# EAGLE schematic kicker (EAGLE 9.6.2)
DDRAWN: 12/31/21; DWG_NO: 1; FINISH: HASL; MATERIAL: FR-4; NDRAWN: Arvind Srinivasan; REV: 4.0; SCALE: 1:1; TITLE: RoboCup SSL Kicker

## Sheet 1 of 9: Power
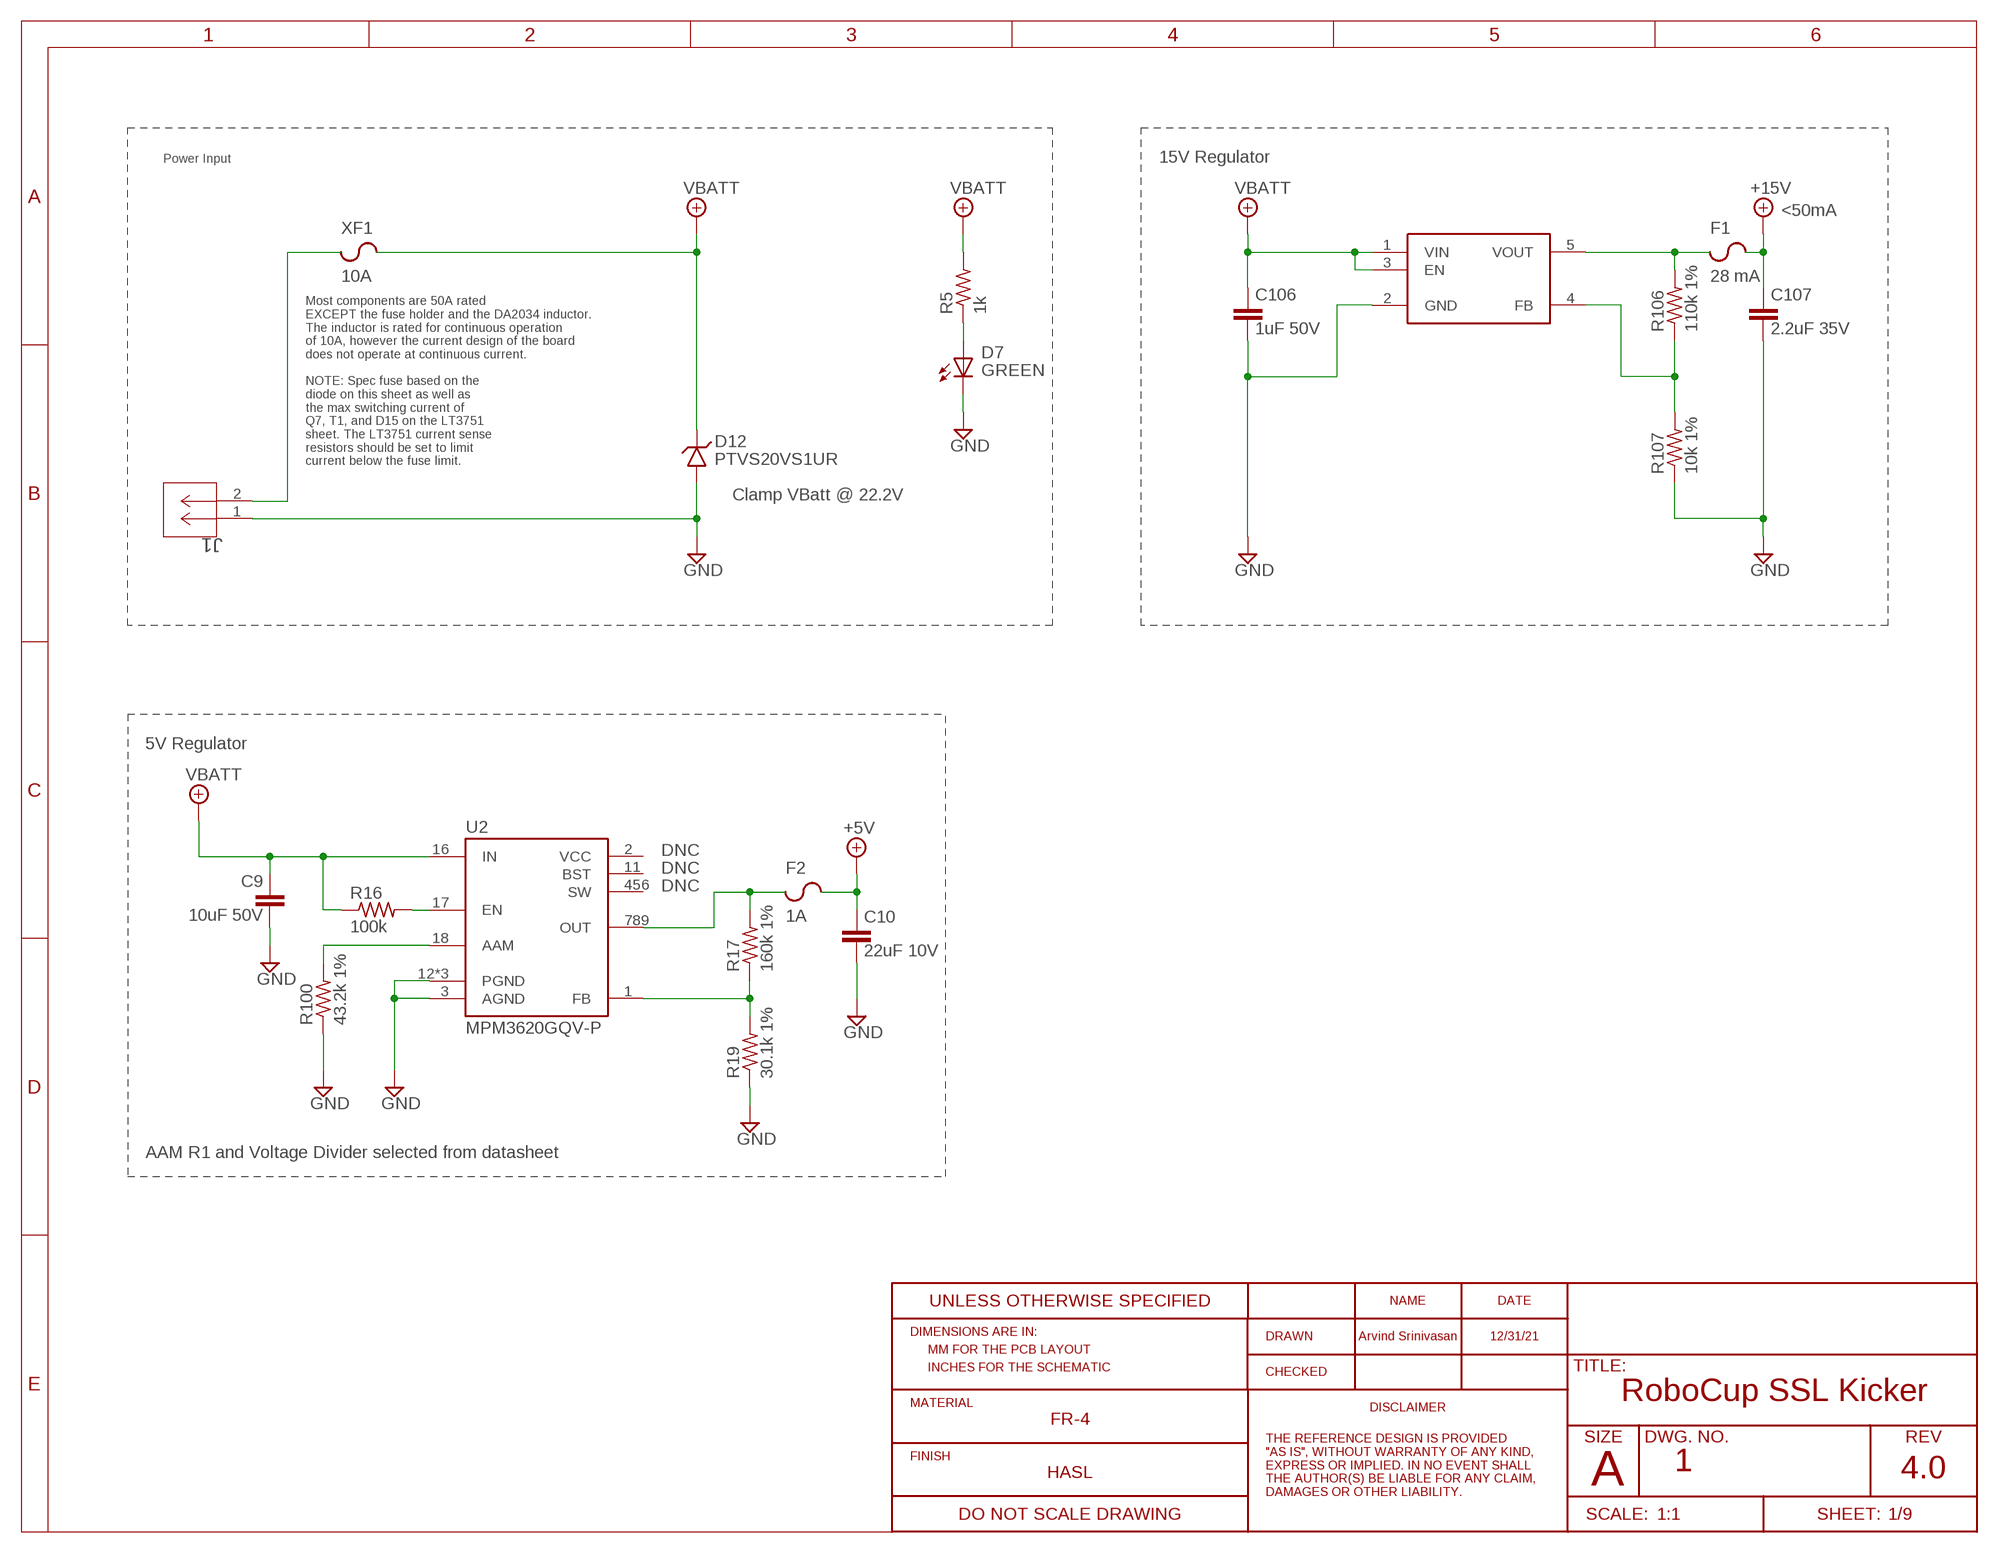
[diagram p0: schematic, sheet 1]
FRAME1 (RO_FRAME_A_L_20161226): REV: 4.0

### Parts
C9  10uF 50V  C-EUC1206  [C1206]
C10  22uF 10V  C-EUC0603  [C0603]
C106  1uF 50V  C-EUC0603  [C0603]
C107  2.2uF 35V  C-EUC0603  [C0603]
D7  GREEN  LED-SMD-GREEN  [CHIP-LED0603]
D12  PTVS20VS1UR  TVSSOD123W  [SOD123-W]
F1  28 mA  CHIP_FUSE0603  [F0603]
F2  1A  CHIP_FUSE0603  [F0603]
J1  436500217  [CON_436500217_MOL]
R5  1k  R-US_R0603  [R0603]
R16  100k  R-US_R0603  [R0603]
R17  160k 1%  R-US_R0603  [R0603]
R19  30.1k 1%  R-US_R0603  [R0603]
R100  43.2k 1%  R-US_R0603  [R0603]
R106  110k 1%  R-US_R0603  [R0603]
R107  10k 1%  R-US_R0603  [R0603]
U2  MPM3620GQV-P  [MPM3620GQV-P]
U100  15V  MIC5235YM5SOT-23-5  [SOT95P280X145-5]
XF1  10A  3557-2  [3557-2]

### Nets
15V_PWR_BR1: D7.A R5.1
+5V: C10.1 F2.2 ; also sheet 3,6,7,8,9
+15V: C107.1 F1.2 ; also sheet 4,7
FB: R17.1 R19.2 U2.1(FB)
GND: C9.2 C10.2 C106.2 C107.2 D7.C(K) D12.A J1.1 R19.1 R100.1 R107.1 U2.3(AGND) U2.12(PGND) U2.13(PGND) U2.14(PGND) U100.2(GND) ; also sheet 2,3,4,5,6,7,8,9
N$6: F1.1 R106.2 U100.5(VOUT)
N$7: F2.1 R17.2 U2.789(OUT)
N$16: R106.1 R107.2 U100.4(FB)
N$39: J1.2 XF1.1 XF1.2
REG_AAM: R100.2 U2.18(AAM)
REG_EN: R16.2 U2.17(EN)
VBATT: C9.1 C106.1 D12.C R5.2 R16.1 U2.16(IN) U100.1(VIN) U100.3(EN) XF1.3 XF1.4 ; also sheet 2,3,5
Unconnected: U2.2(VCC) U2.11(BST) U2.456(SW)

### Notes on the sheet
- Power Input | 15V Regulator
- <50mA
- Most components are 50A rated
  EXCEPT the fuse holder and the DA2034 inductor.
  The inductor is rated for continuous operation
  of 10A, however the current design of the board
  does not operate at continuous current.
- NOTE: Spec fuse based on the
  diode on this sheet as well as
  the max switching current of 
  Q7, T1, and D15 on the LT3751
  sheet. The LT3751 current sense
  resistors should be set to limit
  current below the fuse limit.
- Clamp VBatt @ 22.2V
- 5V Regulator
- DNC
- DNC
- DNC
- AAM R1 and Voltage Divider selected from datasheet

## Sheet 2 of 9: HV - Regulation
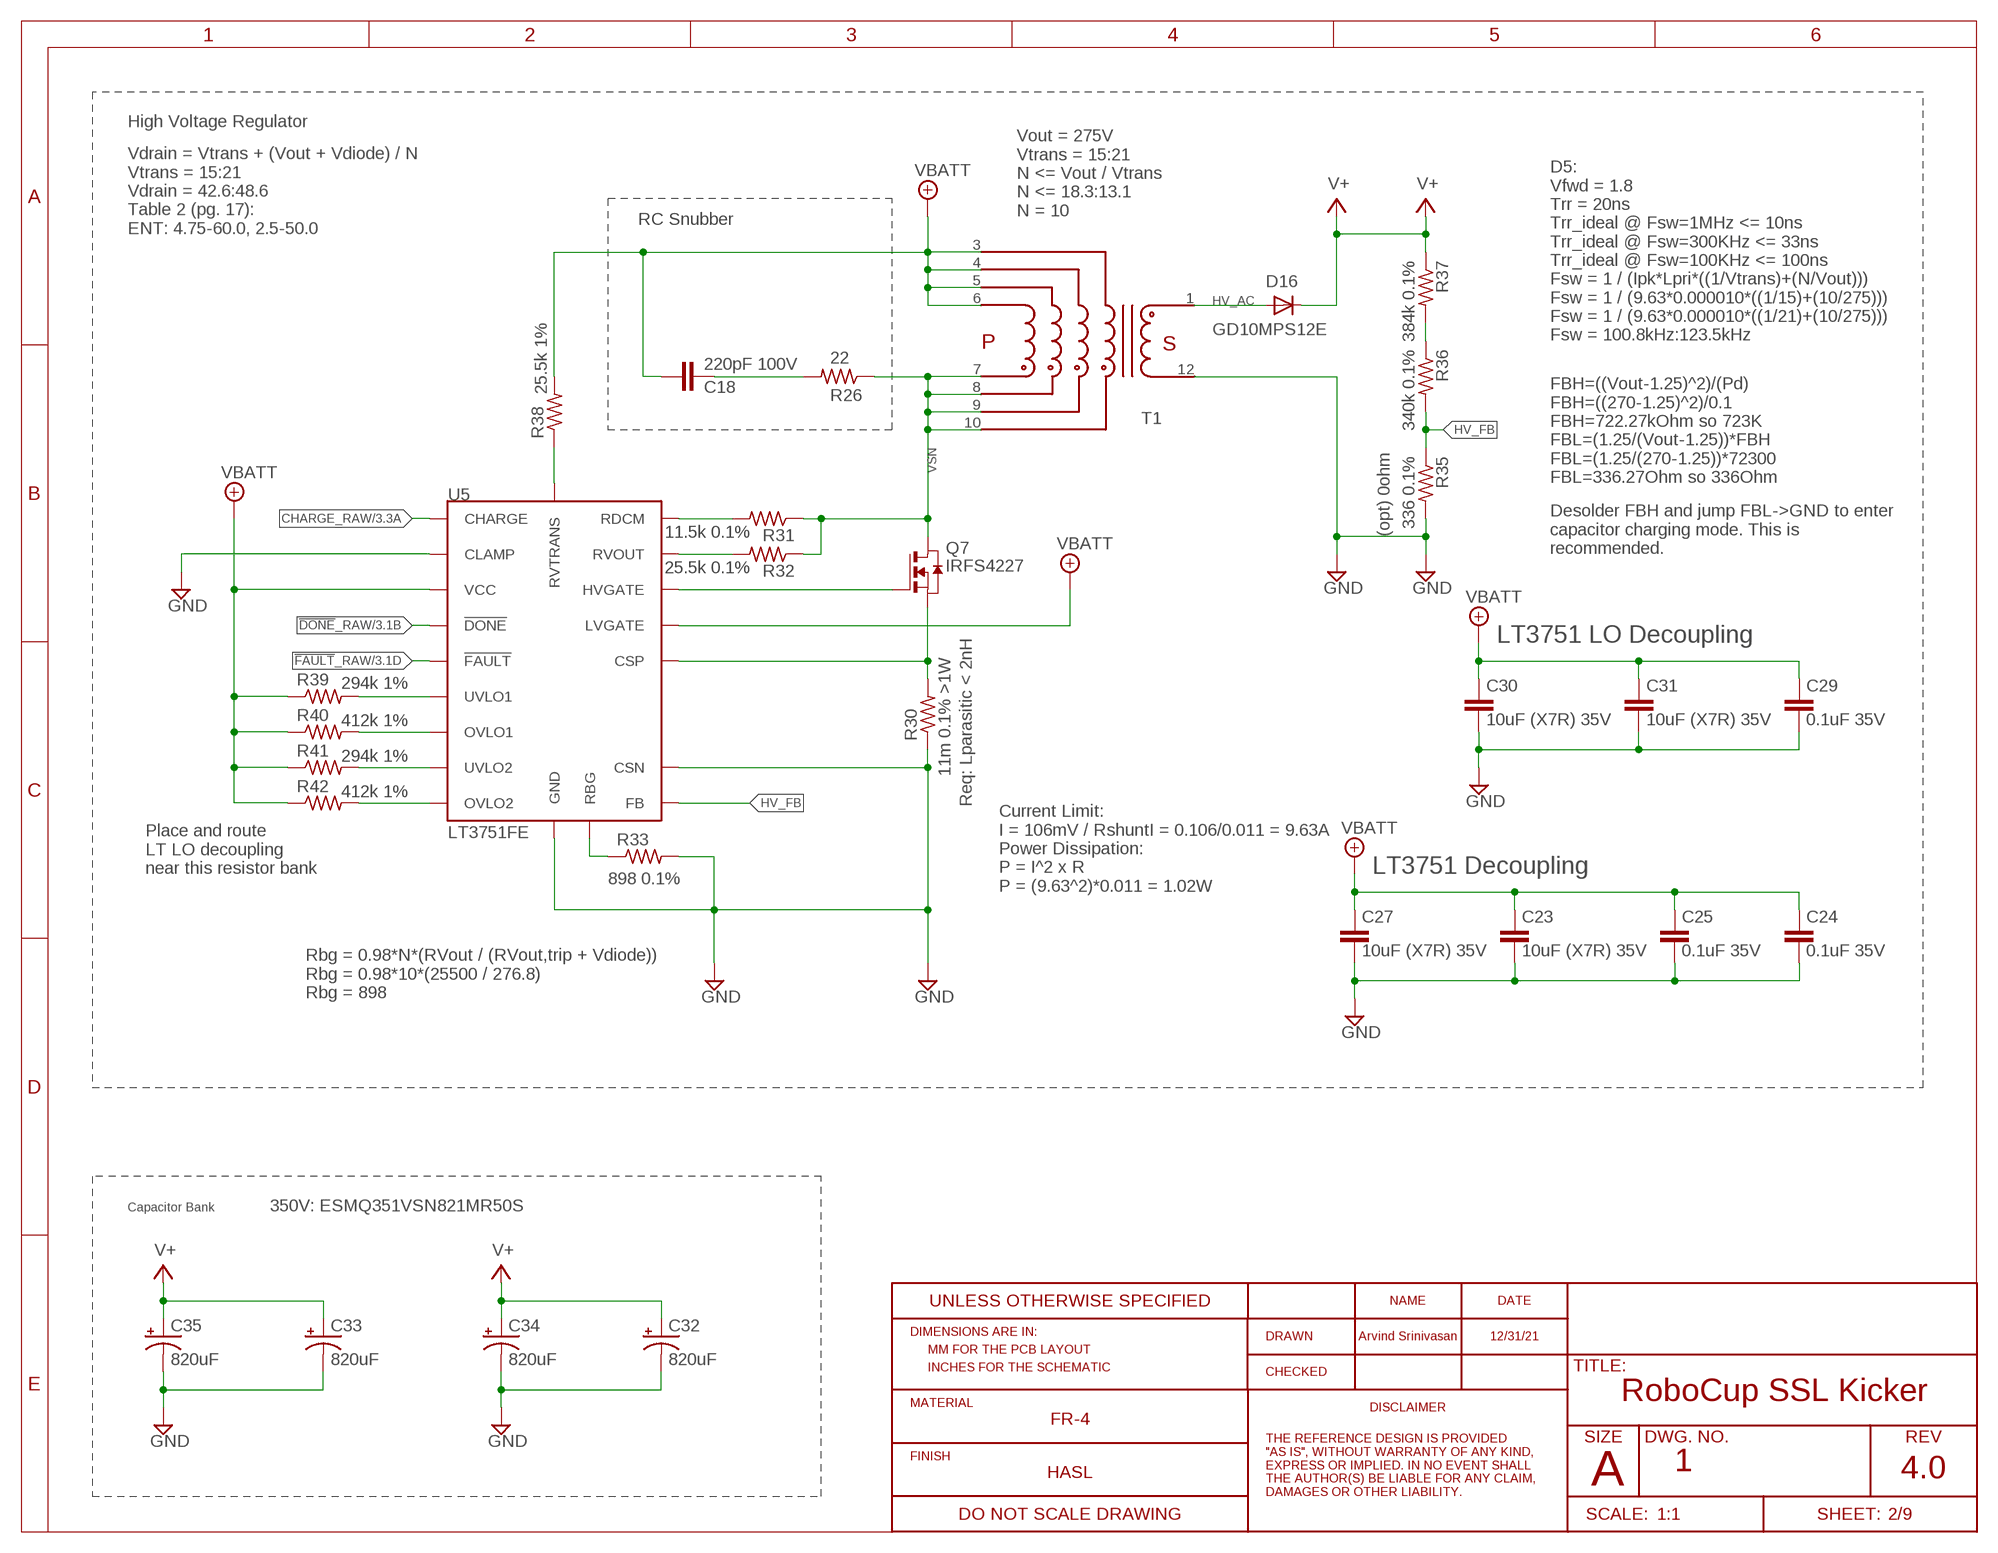
[diagram p1: schematic, sheet 2]
FRAME2 (RO_FRAME_A_L_20161226): REV: 4.0

### Parts
C18  220pF 100V  C-EUC0805  [C0805]
C23  10uF (X7R) 35V  C-EUC1210  [C1210]
C24  0.1uF 35V  C-EUC0805  [C0805]
C25  0.1uF 35V  C-EUC0805  [C0805]
C27  10uF (X7R) 35V  C-EUC1210  [C1210]
C29  0.1uF 35V  C-EUC0805  [C0805]
C30  10uF (X7R) 35V  C-EUC1210  [C1210]
C31  10uF (X7R) 35V  C-EUC1210  [C1210]
C32  820uF  CPOL-USE10-25  [EB25D]
C33  820uF  CPOL-USE10-25  [EB25D]
C34  820uF  CPOL-USE10-25  [EB25D]
C35  820uF  CPOL-USE10-25  [EB25D]
D16  GD10MPS12E  VS-5EWH06FN-M3D-PAK_TO252AA  [TO460P990X239-3]
Q7  IRFS4227  [D2PAK]
R26  22  R-US_R0805  [R0805]
R30  11m 0.1% >1W  R-US_R2512  [R2512]
R31  11.5k 0.1%  R-US_R0805  [R0805]
R32  25.5k 0.1%  R-US_R0805  [R0805]
R33  898 0.1%  R-US_R0805  [R0805]
R35  336 0.1%  R-US_R0603  [R0603]
R36  340k 0.1%  R-US_R0603  [R0603]
R37  384k 0.1%  R-US_R0603  [R0603]
R38  25.5k 1%  R-US_R0805  [R0805]
R39  294k 1%  R-US_R0805  [R0805]
R40  412k 1%  R-US_R0805  [R0805]
R41  294k 1%  R-US_R0805  [R0805]
R42  412k 1%  R-US_R0805  [R0805]
T1  DA203X-ALDA2034  [DA2034]
U5  LT3751FE  [TSSOP-20_EP]

### Nets
!DONE!_RAW: U5.7(!DONE) ; also sheet 3,7
!FAULT!_RAW: U5.6(!FAULT) ; also sheet 3,7
CHARGE_RAW: U5.8(CHARGE) ; also sheet 3
CSP: Q7.3(S) R30.2 U5.12(CSP)
GND: C23.2 C24.2 C25.2 C27.2 C29.2 C30.2 C31.2 C32.- C33.- C34.- C35.- R30.1 R33.2 R35.2 T1.12 U5.9(CLAMP) U5.11(CSN) U5.PAD(GND) ; also sheet 1,3,4,5,6,7,8,9
HV_AC: D16.2(A) T1.1
HV_FB: R35.1 R36.2 U5.10(FB)
HVGATE: Q7.1(G) U5.15(HVGATE)
N$1: R33.1 U5.16(RBG)
N$2: R36.1 R37.2
N$18: C18.1 R26.2
N$24: R38.1 U5.1(RVTRANS)
OVLO1: R40.2 U5.3(OVLO1)
OVLO2: R42.2 U5.5(OVLO2)
RDCM: R31.2 U5.20(RDCM)
RVOUT: R32.2 U5.18(RVOUT)
UVLO1: R39.2 U5.2(UVLO1)
UVLO2: R41.2 U5.4(UVLO2)
V+: C32.+ C33.+ C34.+ C35.+ D16.3(C) R37.1 ; also sheet 4,5,6,7
VBATT: C18.2 C23.1 C24.1 C25.1 C27.1 C29.1 C30.1 C31.1 R38.2 R39.1 R40.1 R41.1 R42.1 T1.3 T1.4 T1.5 T1.6 U5.13(VCC) U5.14(LVGATE) ; also sheet 1,3,5
VSN: Q7.2(D) R26.1 R31.1 R32.1 T1.7 T1.8 T1.9 T1.10

### Notes on the sheet
- High Voltage Regulator
- Vout = 275V
  Vtrans = 15:21
  N <= Vout / Vtrans
  N <= 18.3:13.1
  N = 10
- RC Snubber
- Vdrain = Vtrans + (Vout + Vdiode) / N
  Vtrans = 15:21
  Vdrain = 42.6:48.6
  Table 2 (pg. 17):
  ENT: 4.75-60.0, 2.5-50.0
- D5:
  Vfwd = 1.8
  Trr = 20ns
  Trr_ideal @ Fsw=1MHz <= 10ns
  Trr_ideal @ Fsw=300KHz <= 33ns
  Trr_ideal @ Fsw=100KHz <= 100ns
  Fsw = 1 / (Ipk*Lpri*((1/Vtrans)+(N/Vout)))
  Fsw = 1 / (9.63*0.000010*((1/15)+(10/275)))
  Fsw = 1 / (9.63*0.000010*((1/21)+(10/275)))
  Fsw = 100.8kHz:123.5kHz
- FBH=((Vout-1.25)^2)/(Pd)
  FBH=((270-1.25)^2)/0.1
  FBH=722.27kOhm so 723K
  FBL=(1.25/(Vout-1.25))*FBH
  FBL=(1.25/(270-1.25))*72300
  FBL=336.27Ohm so 336Ohm
- (opt) 0ohm
- Desolder FBH and jump FBL->GND to enter
  capacitor charging mode. This is
  recommended.
- LT3751 LO Decoupling
- Req: Lparasitic < 2nH
- Place and route
  LT LO decoupling
  near this resistor bank
- LT3751 Decoupling
- Current Limit:
  I = 106mV / RshuntI = 0.106/0.011 = 9.63A
  Power Dissipation:
  P = I^2 x R
  P = (9.63^2)*0.011 = 1.02W
- Rbg = 0.98*N*(RVout / (RVout,trip + Vdiode))
  Rbg = 0.98*10*(25500 / 276.8)
  Rbg = 898
- Capacitor Bank | 350V: ESMQ351VSN821MR50S

## Sheet 3 of 9: HV - Control & Bypass
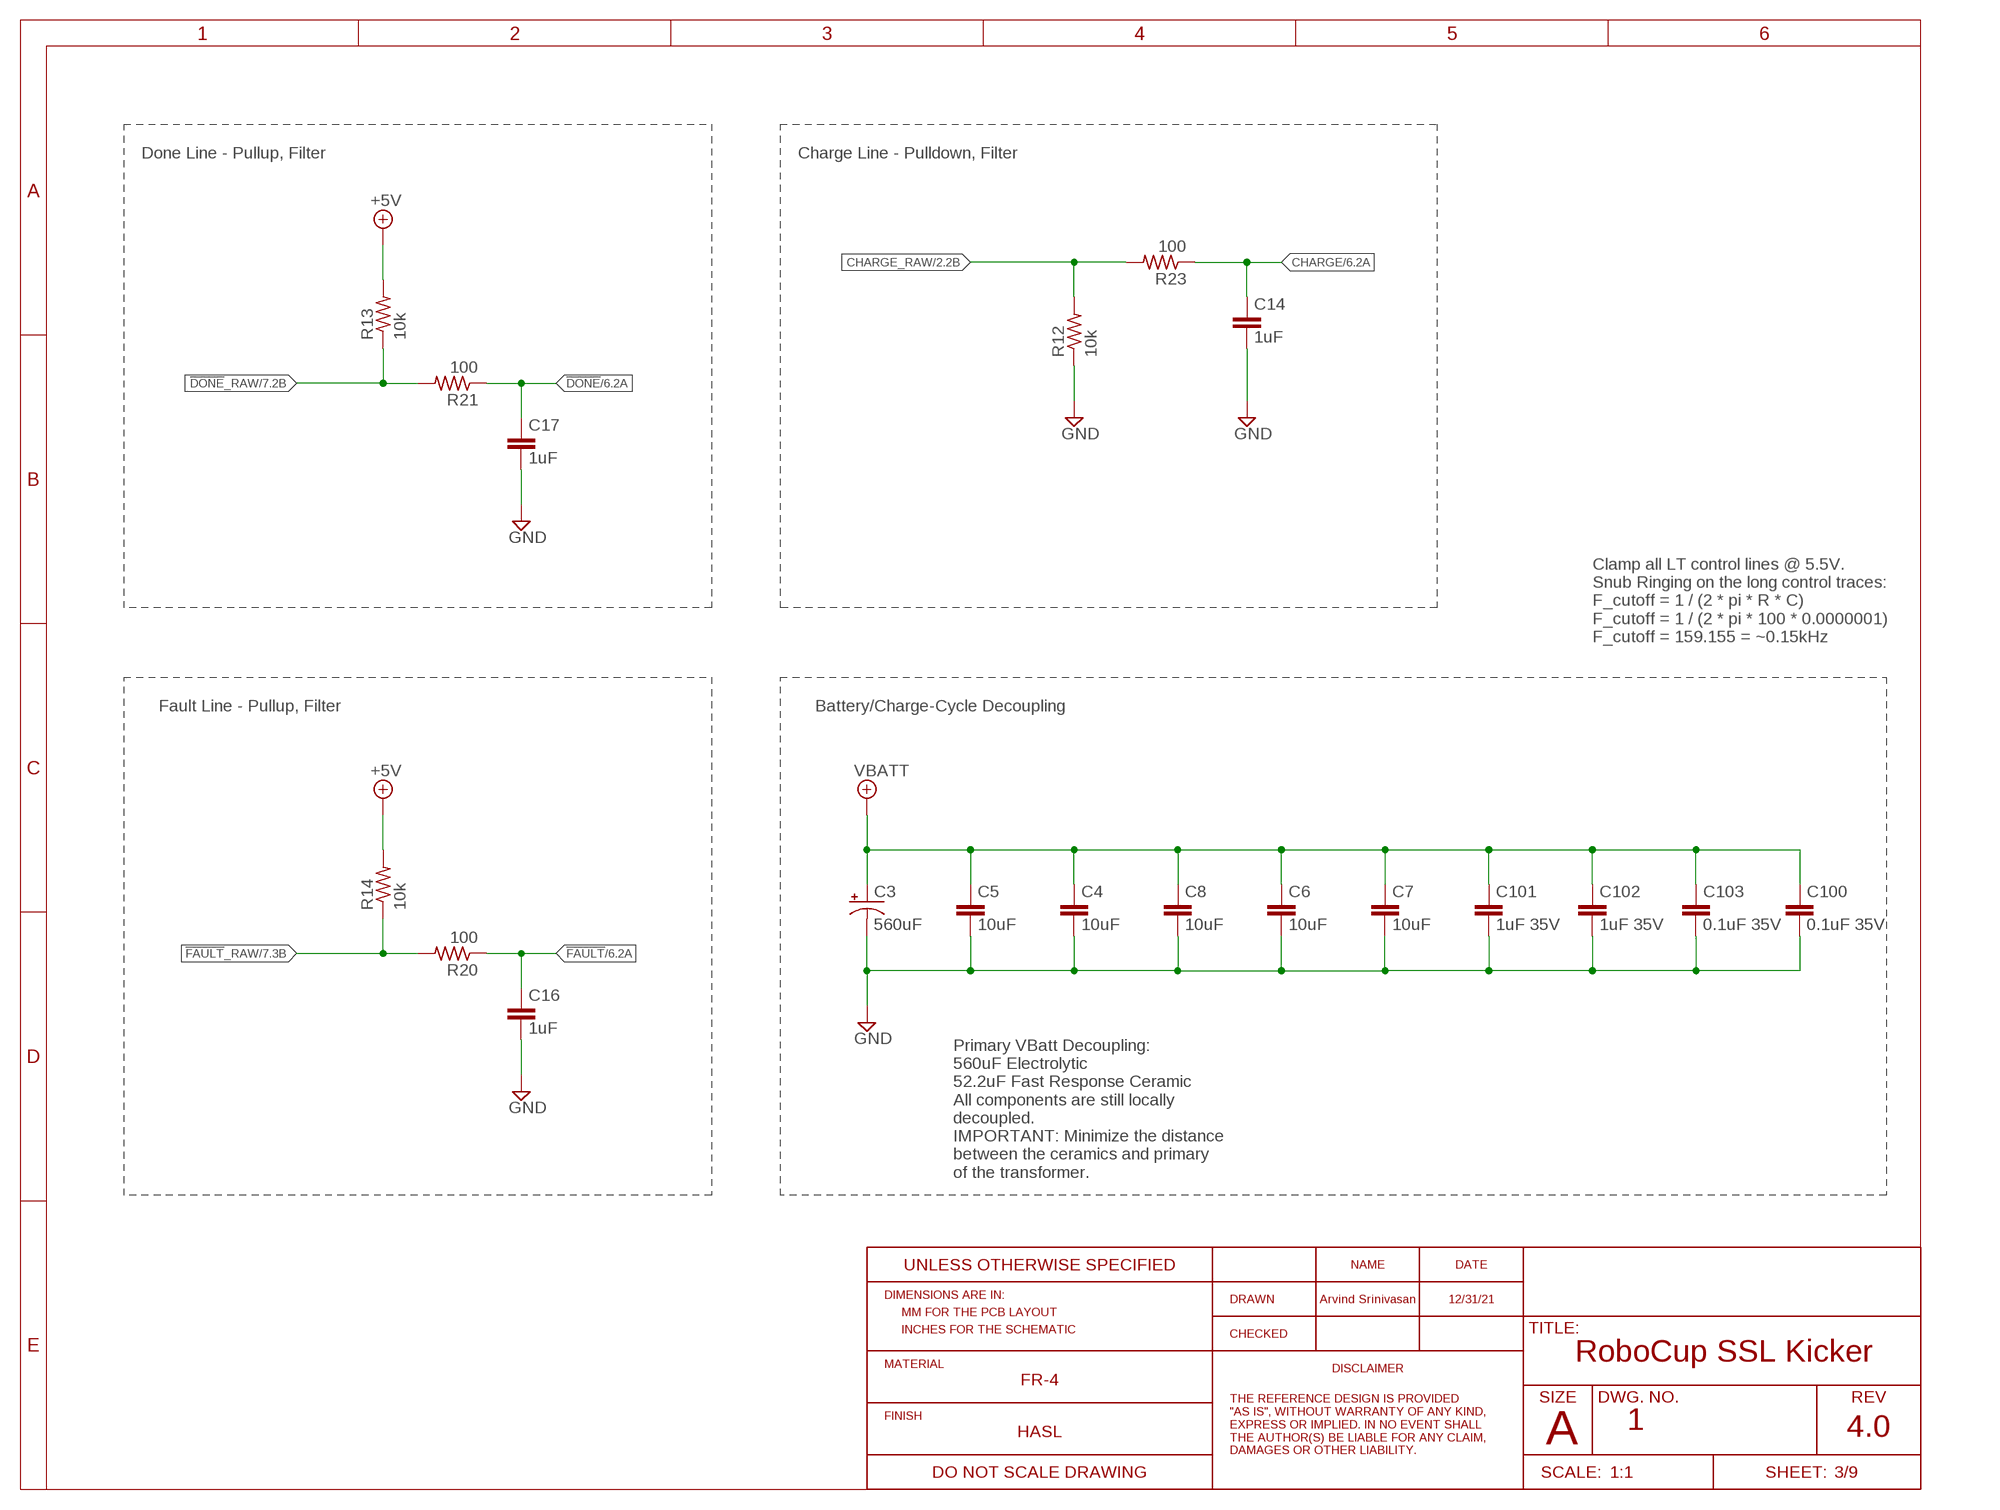
[diagram p2: schematic, sheet 3]

### Parts
C3  560uF  CPOL-USE7.5-18  [E7,5-18]
C4  10uF  C-EUC1210  [C1210]
C5  10uF  C-EUC1210  [C1210]
C6  10uF  C-EUC1210  [C1210]
C7  10uF  C-EUC1210  [C1210]
C8  10uF  C-EUC1210  [C1210]
C14  1uF  C-EUC0603  [C0603]
C16  1uF  C-EUC0603  [C0603]
C17  1uF  C-EUC0603  [C0603]
C100  0.1uF 35V  C-EUC0805  [C0805]
C101  1uF 35V  C-EUC0805  [C0805]
C102  1uF 35V  C-EUC0805  [C0805]
C103  0.1uF 35V  C-EUC0805  [C0805]
R12  10k  R-US_R0603  [R0603]
R13  10k  R-US_R0603  [R0603]
R14  10k  R-US_R0603  [R0603]
R20  100  R-US_R0603  [R0603]
R21  100  R-US_R0603  [R0603]
R23  100  R-US_R0603  [R0603]

### Nets
!DONE!: C17.1 R21.1 ; also sheet 6
!DONE!_RAW: R13.1 R21.2 ; also sheet 2,7
!FAULT!: C16.1 R20.1 ; also sheet 6
!FAULT!_RAW: R14.1 R20.2 ; also sheet 2,7
+5V: R13.2 R14.2 ; also sheet 1,6,7,8,9
CHARGE: C14.1 R23.1 ; also sheet 6
CHARGE_RAW: R12.2 R23.2 ; also sheet 2
GND: C3.- C4.2 C5.2 C6.2 C7.2 C8.2 C14.2 C16.2 C17.2 C100.2 C101.2 C102.2 C103.2 R12.1 ; also sheet 1,2,4,5,6,7,8,9
VBATT: C3.+ C4.1 C5.1 C6.1 C7.1 C8.1 C100.1 C101.1 C102.1 C103.1 ; also sheet 1,2,5

### Notes on the sheet
- Done Line - Pullup, Filter | Charge Line - Pulldown, Filter
- Clamp all LT control lines @ 5.5V.
  Snub Ringing on the long control traces:
  F_cutoff = 1 / (2 * pi * R * C)
  F_cutoff = 1 / (2 * pi * 100 * 0.0000001)
  F_cutoff = 159.155 = ~0.15kHz
- Fault Line - Pullup, Filter | Battery/Charge-Cycle Decoupling
- Primary VBatt Decoupling:
  560uF Electrolytic
  52.2uF Fast Response Ceramic
  All components are still locally
  decoupled.
  IMPORTANT: Minimize the distance
  between the ceramics and primary
  of the transformer.

## Sheet 4 of 9: HV - Kick Discharge
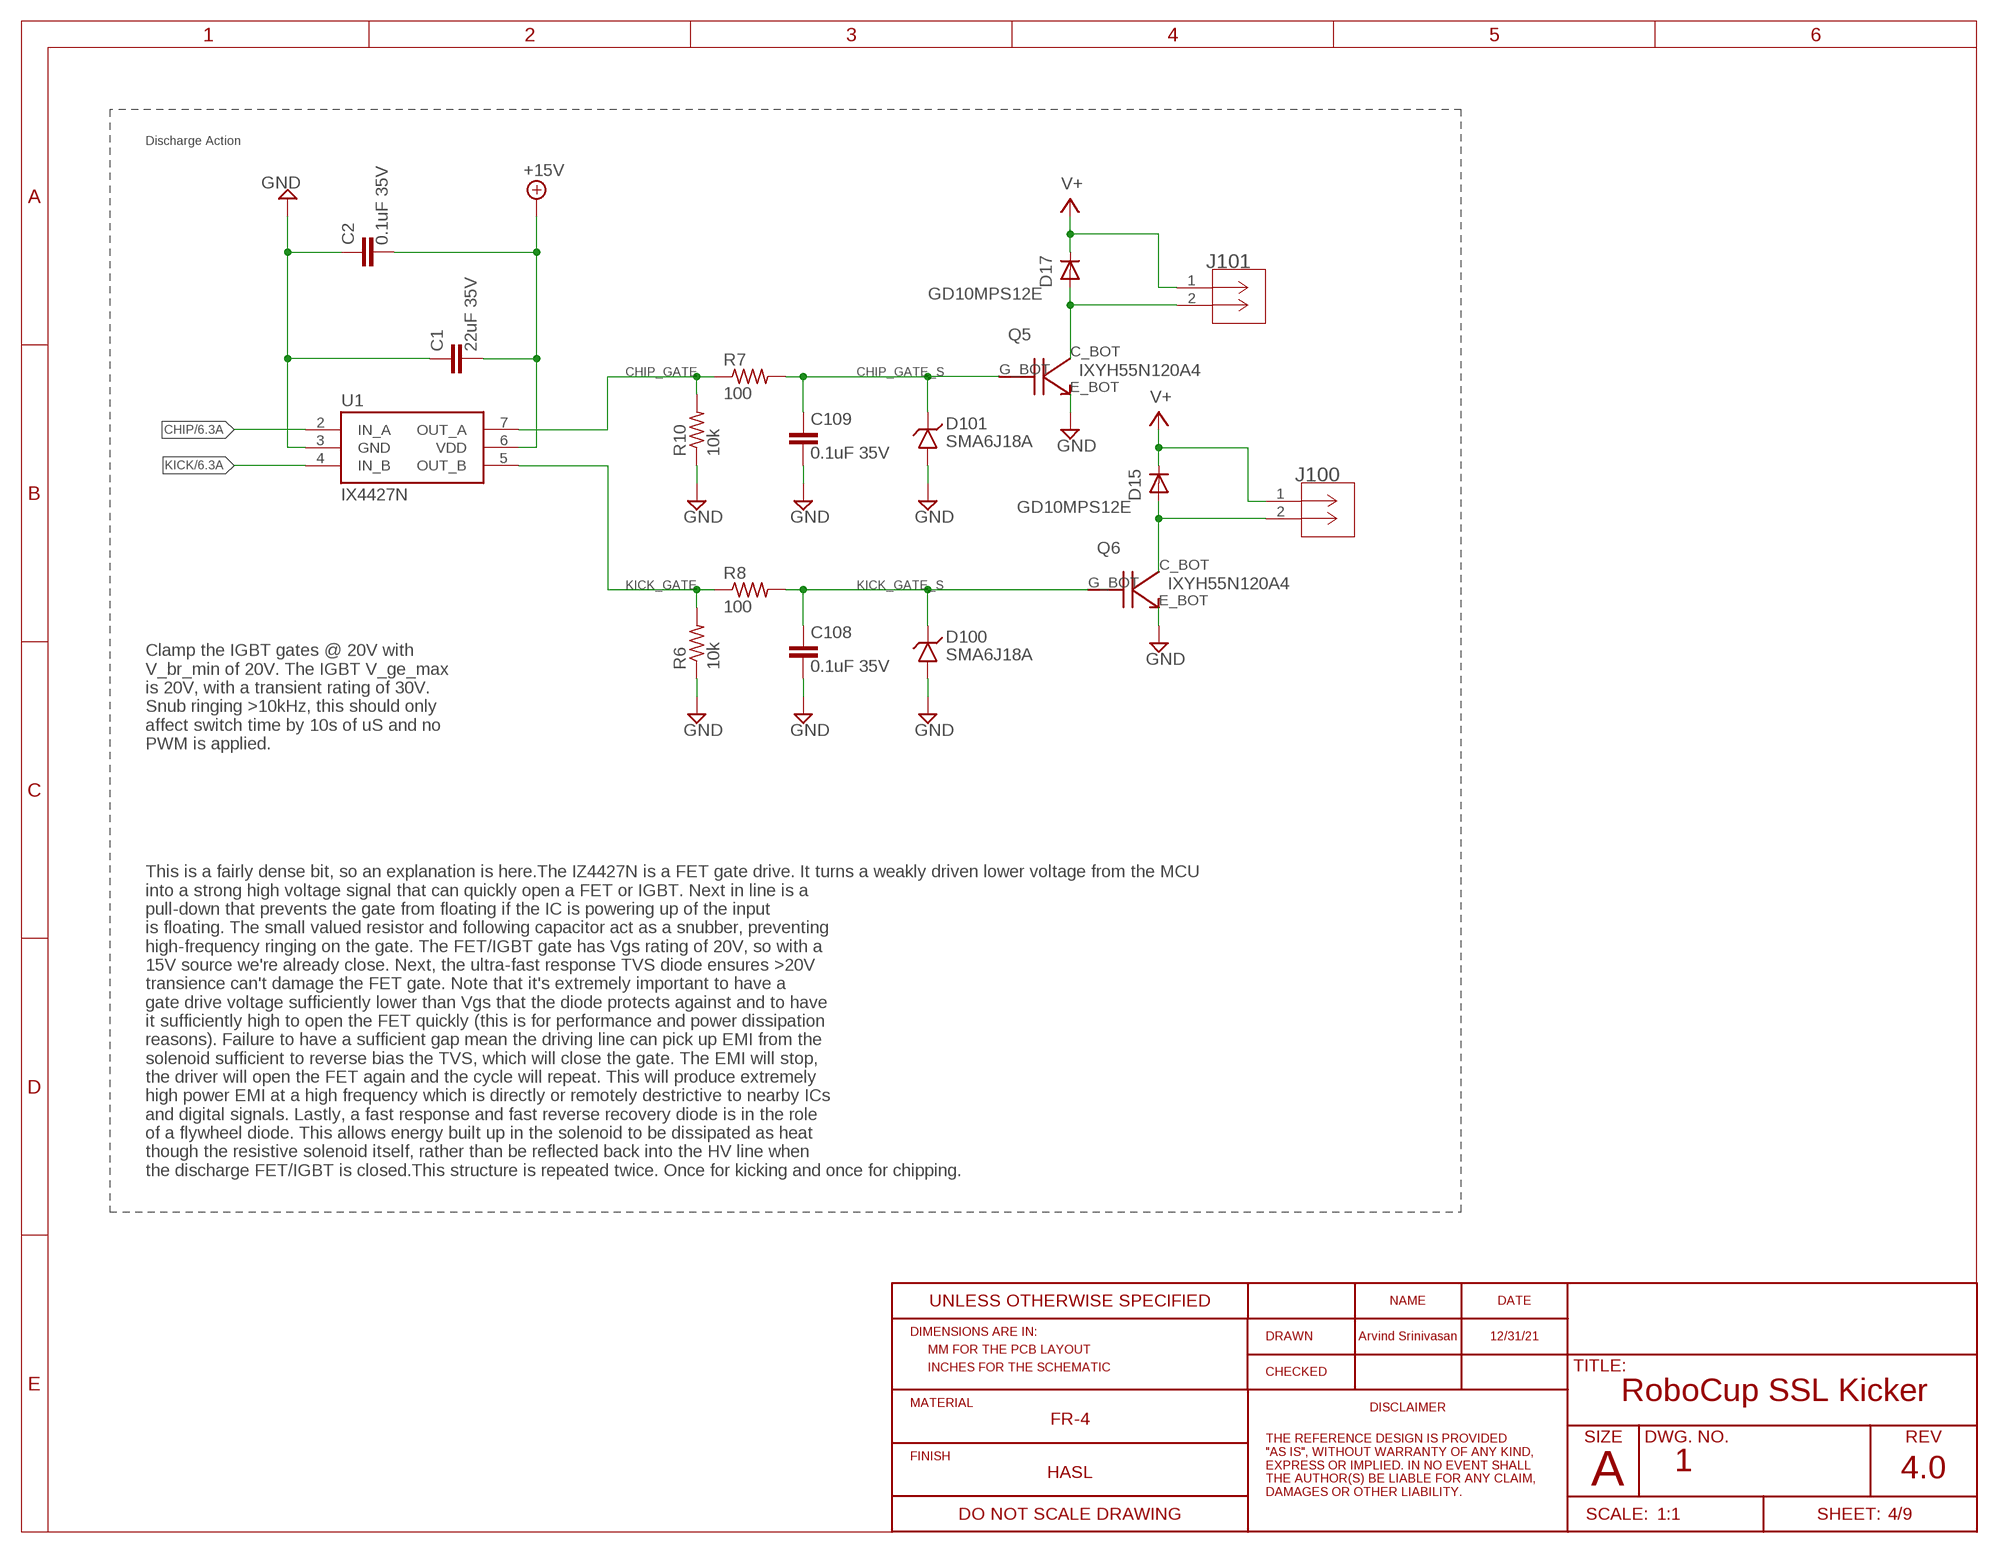
[diagram p3: schematic, sheet 4]

### Parts
C1  22uF 35V  C-EUC0805  [C0805]
C2  0.1uF 35V  C-EUC0805  [C0805]
C108  0.1uF 35V  C-EUC0603  [C0603]
C109  0.1uF 35V  C-EUC0603  [C0603]
D15  GD10MPS12E  VS-5EWH06FN-M3D-PAK_TO252AA  [TO460P990X239-3]
D17  GD10MPS12E  VS-5EWH06FN-M3D-PAK_TO252AA  [TO460P990X239-3]
D100  SMA6J18A  SMAJ20ADO-214AC  [RESM5226X262]
D101  SMA6J18A  SMAJ20ADO-214AC  [RESM5226X262]
J100  436500202  [CON_436500202_MOL]
J101  436500202  [CON_436500202_MOL]
Q5  IXYH55N120A4  IXGK400N30A3  [TO264]
Q6  IXYH55N120A4  IXGK400N30A3  [TO264]
R6  10k  R-US_R0603  [R0603]
R7  100  R-US_R1206  [R1206]
R8  100  R-US_R1206  [R1206]
R10  10k  R-US_R0603  [R0603]
U1  IX4427N  [SOIC-8]

### Nets
+15V: C1.2 C2.2 U1.6(VDD) ; also sheet 1,7
CHIP: U1.2(IN_A) ; also sheet 6
CHIP_GATE: R7.1 R10.2 U1.7(OUT_A)
CHIP_GATE_S: C109.1 D101.2(C) Q5.G_BOT(G) R7.2
CHIPPER: D17.2(A) J101.2 Q5.C_BOT(C)
GND: C1.1 C2.1 C108.2 C109.2 D100.1(A) D101.1(A) Q5.E_BOT(E) Q6.E_BOT(E) R6.1 R10.1 U1.3(GND) ; also sheet 1,2,3,5,6,7,8,9
KICK: U1.4(IN_B) ; also sheet 6
KICK_GATE: R6.2 R8.1 U1.5(OUT_B)
KICK_GATE_S: C108.1 D100.2(C) Q6.G_BOT(G) R8.2
KICKER: D15.2(A) J100.2 Q6.C_BOT(C)
V+: D15.3(C) D17.3(C) J100.1 J101.1 ; also sheet 2,5,6,7

### Notes on the sheet
- Discharge Action
- Clamp the IGBT gates @ 20V with
  V_br_min of 20V. The IGBT V_ge_max
  is 20V, with a transient rating of 30V.
  Snub ringing >10kHz, this should only
  affect switch time by 10s of uS and no
  PWM is applied.
- This is a fairly dense bit, so an explanation is here.The IZ4427N is a FET gate drive. It turns a weakly driven lower voltage from the MCU
  into a strong high voltage signal that can quickly open a FET or IGBT. Next in line is a
  pull-down that prevents the gate from floating if the IC is powering up of the input
  is floating. The small valued resistor and following capacitor act as a snubber, preventing
  high-frequency ringing on the gate. The FET/IGBT gate has Vgs rating of 20V, so with a
  15V source we're already close. Next, the ultra-fast response TVS diode ensures >20V
  transience can't damage the FET gate. Note that it's extremely important to have a
  gate drive voltage sufficiently lower than Vgs that the diode protects against and to have
  it sufficiently high to open the FET quickly (this is for performance and power dissipation
  reasons). Failure to have a sufficient gap mean the driving line can pick up EMI from the
  solenoid sufficient to reverse bias the TVS, which will close the gate. The EMI will stop,
  the driver will open the FET again and the cycle will repeat. This will produce extremely
  high power EMI at a high frequency which is directly or remotely destrictive to nearby ICs
  and digital signals. Lastly, a fast response and fast reverse recovery diode is in the role
  of a flywheel diode. This allows energy built up in the solenoid to be dissipated as heat
  though the resistive solenoid itself, rather than be reflected back into the HV line when
  the discharge FET/IGBT is closed.This structure is repeated twice. Once for kicking and once for chipping.

## Sheet 5 of 9: HV - Auto Discharge
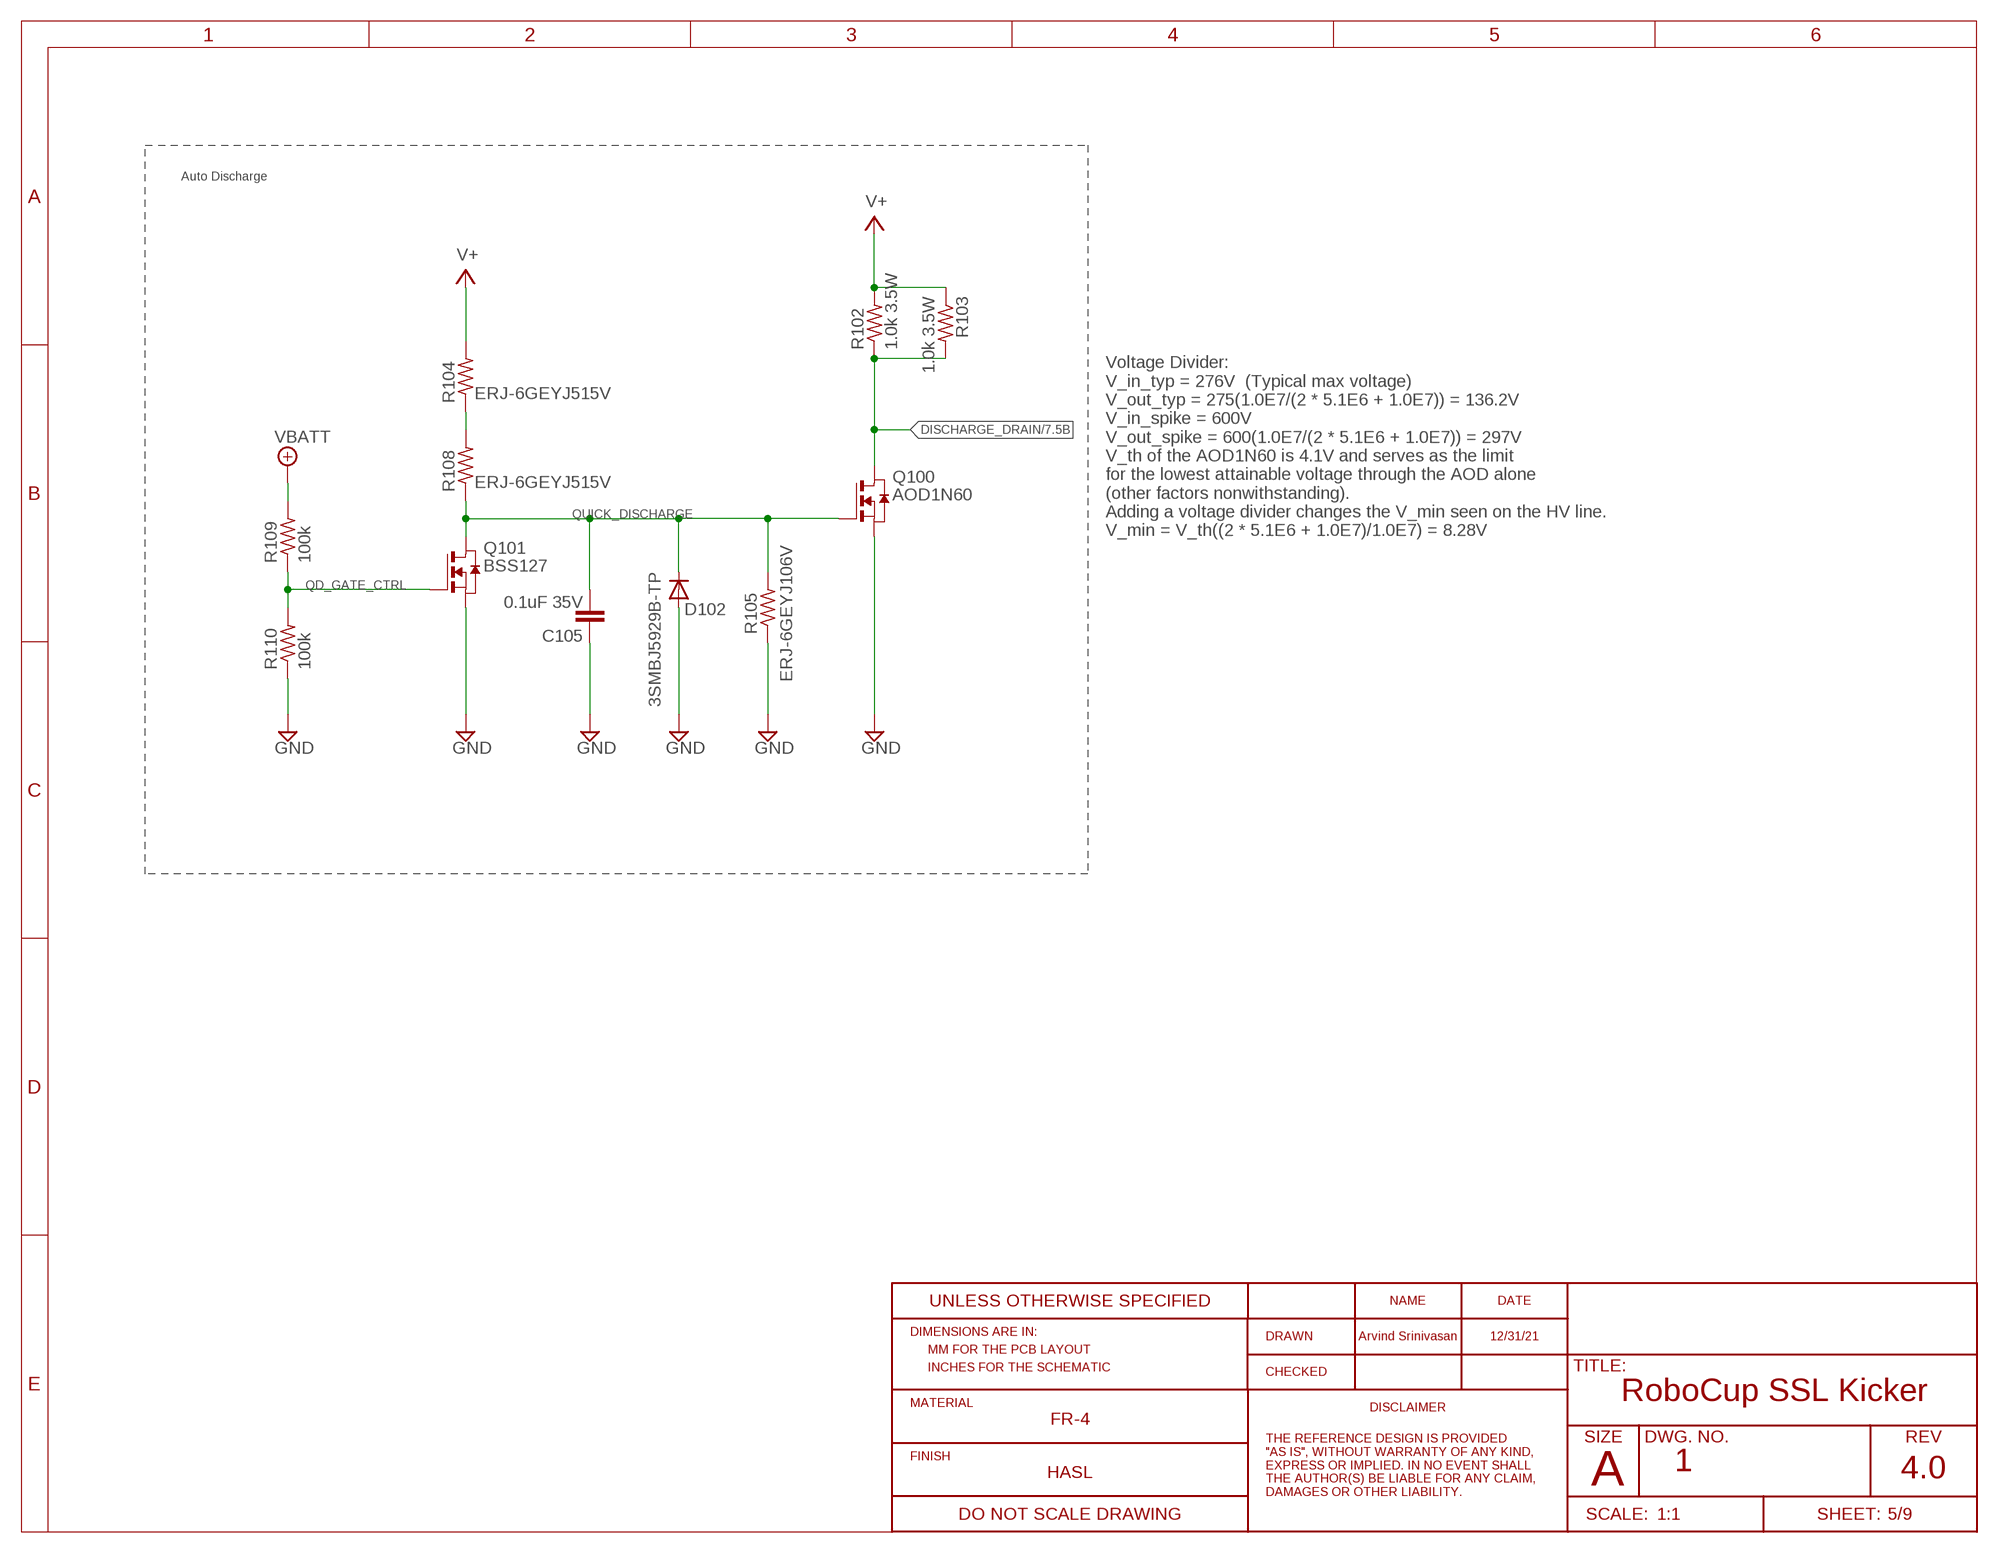
[diagram p4: schematic, sheet 5]
FRAME5 (RO_FRAME_A_L_20161226): REV: 4.0

### Parts
C105  0.1uF 35V  C-EUC0603  [C0603]
D102  3SMBJ5929B-TP  DIODE-DO214AA  [DO214AA]
Q100  AOD1N60  [DPAK]
Q101  BSS127  [SOT-23-3]
R102  1.0k 3.5W  PWR263S-35TO-263AB  [TO508P1539X450-3]
R103  1.0k 3.5W  PWR263S-35TO-263AB  [TO508P1539X450-3]
R104  ERJ-6GEYJ515V  R-US_R0805  [R0805]
R105  ERJ-6GEYJ106V  R-US_R0603  [R0603]
R108  ERJ-6GEYJ515V  R-US_R0805  [R0805]
R109  100k  R-US_R0603  [R0603]
R110  100k  R-US_R0603  [R0603]

### Nets
DISCHARGE_DRAIN: Q100.4(D) R102.1(PIN1) R103.2(PIN2) ; also sheet 7
GND: C105.1 D102.A Q100.3(S) Q101.2(S) R105.1 R110.1 ; also sheet 1,2,3,4,6,7,8,9
QD_GATE_CTRL: Q101.1(G) R109.1 R110.2
QD_PU_BR: R104.1 R108.2
QUICK_DISCHARGE: C105.2 D102.C Q100.1(G) Q101.3(D) R105.2 R108.1
V+: R102.2(PIN2) R103.1(PIN1) R104.2 ; also sheet 2,4,6,7
VBATT: R109.2 ; also sheet 1,2,3

### Notes on the sheet
- Auto Discharge
- Voltage Divider:
  V_in_typ = 276V  (Typical max voltage)
  V_out_typ = 275(1.0E7/(2 * 5.1E6 + 1.0E7)) = 136.2V
  V_in_spike = 600V
  V_out_spike = 600(1.0E7/(2 * 5.1E6 + 1.0E7)) = 297V
  V_th of the AOD1N60 is 4.1V and serves as the limit
  for the lowest attainable voltage through the AOD alone
  (other factors nonwithstanding). 
  Adding a voltage divider changes the V_min seen on the HV line.
  V_min = V_th((2 * 5.1E6 + 1.0E7)/1.0E7) = 8.28V

## Sheet 6 of 9: MCU
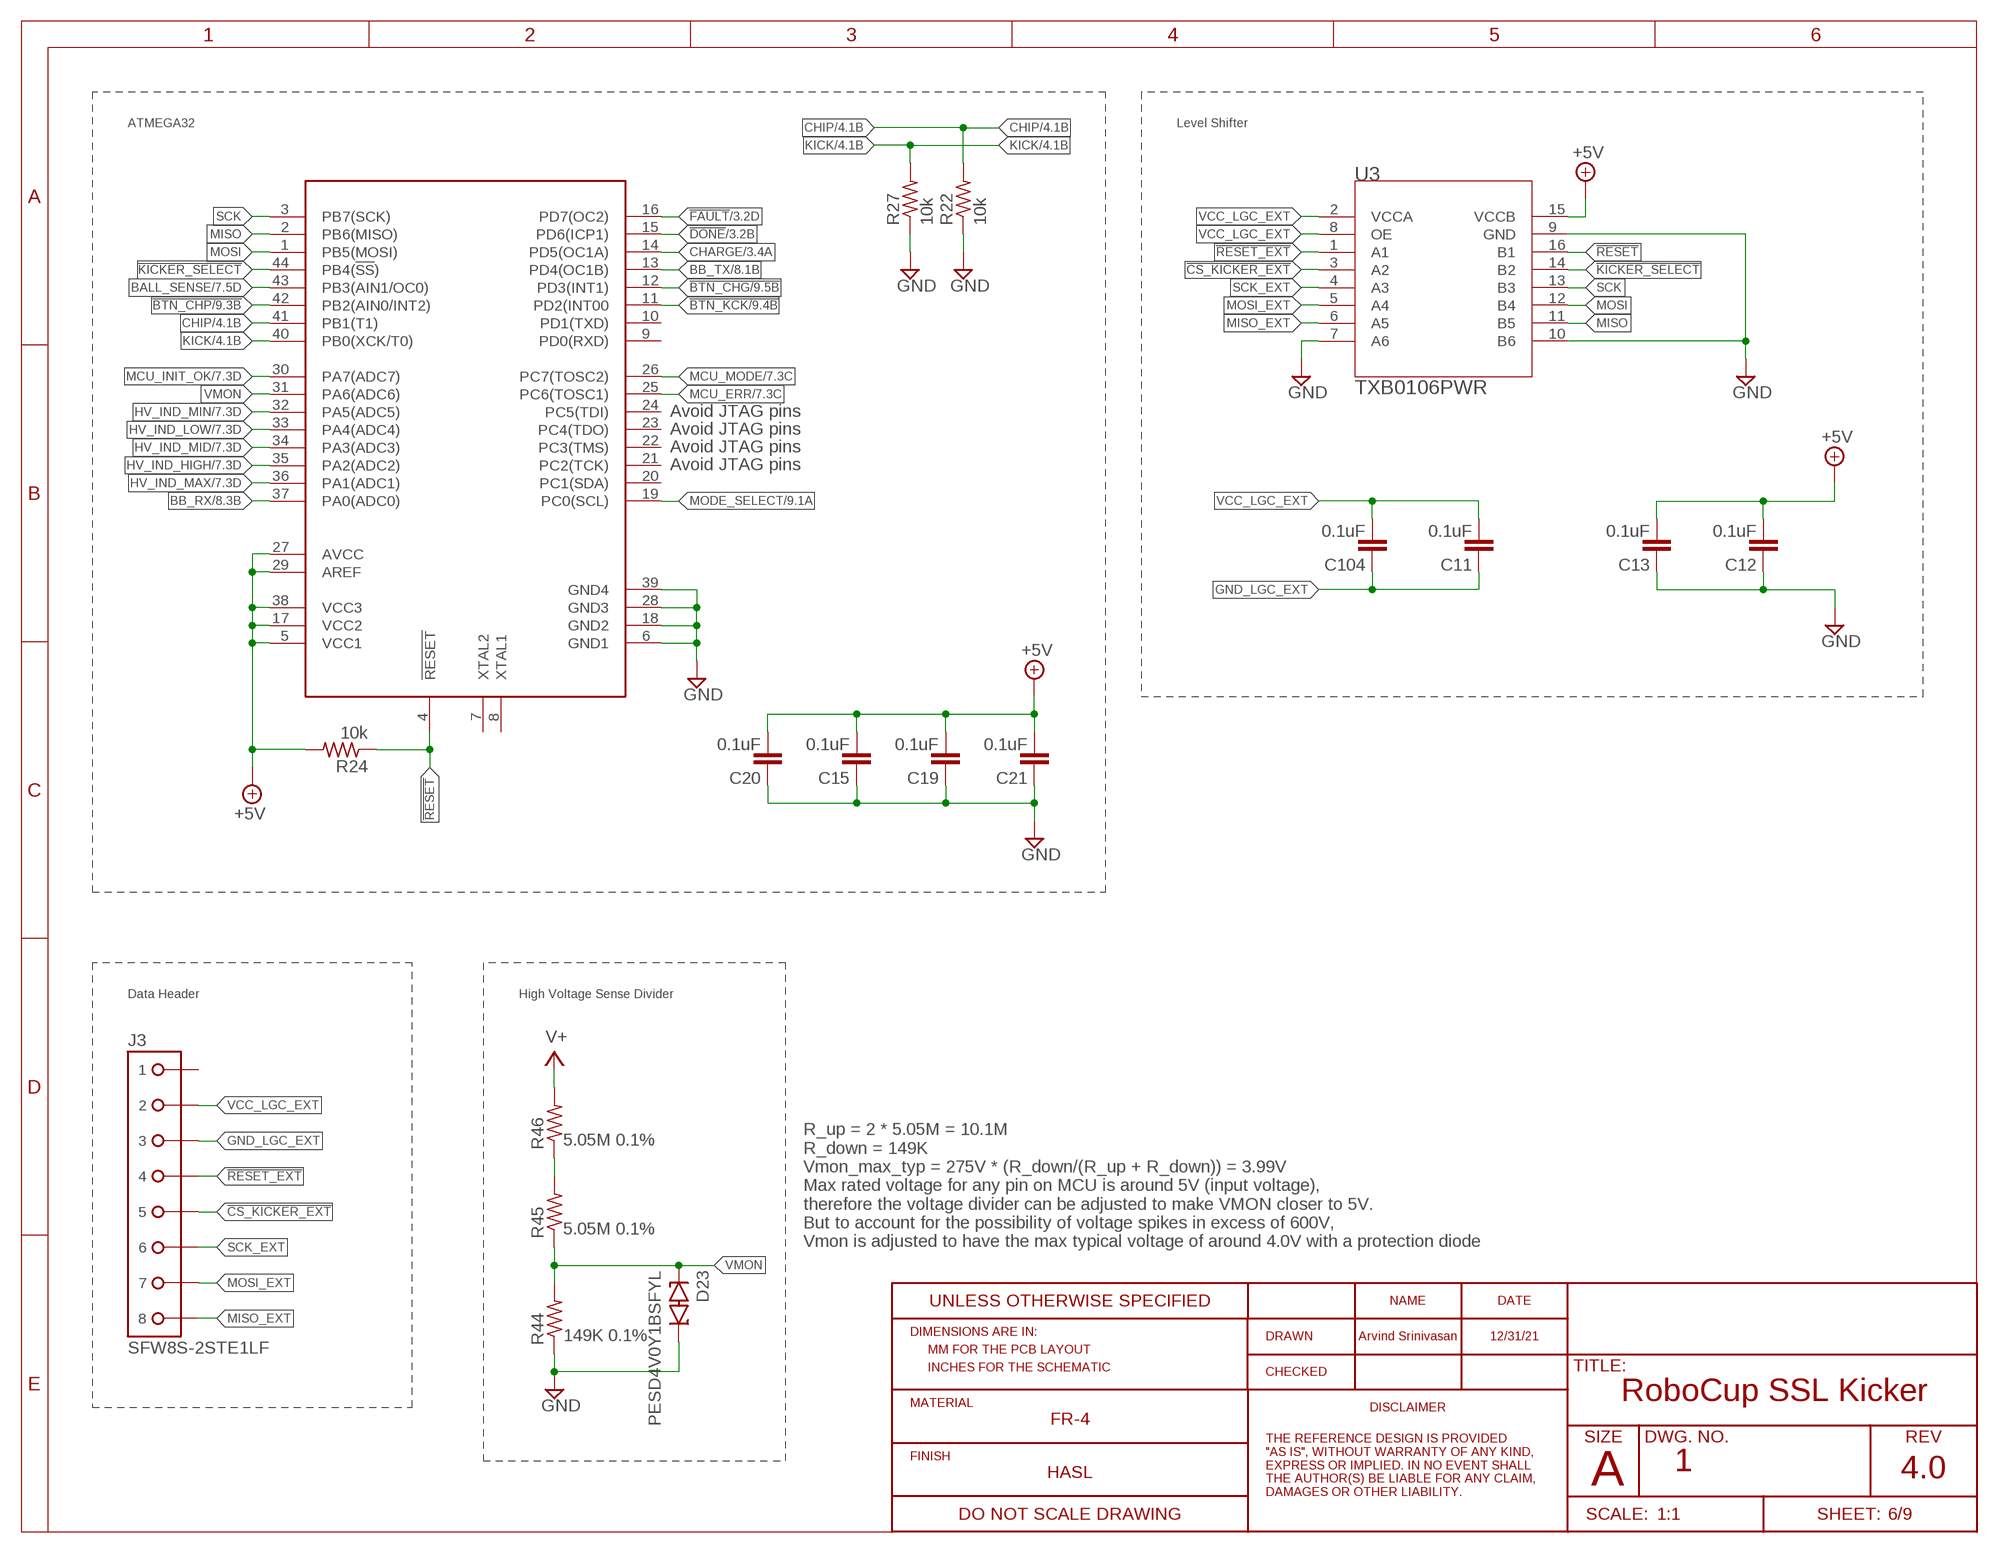
[diagram p5: schematic, sheet 6]
FRAME6 (RO_FRAME_A_L_20161226): REV: 4.0

### Parts
C11  0.1uF  C-EUC0603  [C0603]
C12  0.1uF  C-EUC0603  [C0603]
C13  0.1uF  C-EUC0603  [C0603]
C15  0.1uF  C-EUC0603  [C0603]
C19  0.1uF  C-EUC0603  [C0603]
C20  0.1uF  C-EUC0603  [C0603]
C21  0.1uF  C-EUC0603  [C0603]
C104  0.1uF  C-EUC0603  [C0603]
D23  PESD4V0Y1BSFYL  [DSN0603-2]
J3  SFW8S-2STE1LF  [CON8_1X8_UB_SFW_JAE]
R22  10k  R-US_R0603  [R0603]
R24  10k  R-US_R0603  [R0603]
R27  10k  R-US_R0603  [R0603]
R44  149K 0.1%  R-US_R0603  [R0603]
R45  5.05M 0.1%  R-US_R0805  [R0805]
R46  5.05M 0.1%  R-US_R0805  [R0805]
U3  TXB0106PWR  [PW16]
U4  AT32ATQFP44  [QFP80P1200X1200X120-44]

### Nets
!BTN_CHG: U4.12(PD3(INT1)) ; also sheet 9
!BTN_CHP: U4.42(PB2(AIN0/INT2)) ; also sheet 9
!BTN_KCK: U4.11(PD2(INT00) ; also sheet 9
!CS_KICKER_EXT: J3.5 U3.3(A2)
!DONE!: U4.15(PD6(ICP1)) ; also sheet 3
!FAULT!: U4.16(PD7(OC2)) ; also sheet 3
!KICKER_SELECT: U3.14(B2) U4.44(PB4(!SS!))
!RESET: R24.1 U3.16(B1) U4.4(!RESET!)
!RESET_EXT: J3.4 U3.1(A1)
+5V: C12.2 C13.2 C15.2 C19.2 C20.2 C21.2 R24.2 U3.15(VCCB) U4.5(VCC1) U4.17(VCC2) U4.27(AVCC) U4.29(AREF) U4.38(VCC3) ; also sheet 1,3,7,8,9
BALL_SENSE: U4.43(PB3(AIN1/OC0)) ; also sheet 7
BB_RX: U4.37(PA0(ADC0)) ; also sheet 8
BB_TX: U4.13(PD4(OC1B)) ; also sheet 8
CHARGE: U4.14(PD5(OC1A)) ; also sheet 3
CHIP: R22.2 U4.41(PB1(T1)) ; also sheet 4
GND: C12.1 C13.1 C15.1 C19.1 C20.1 C21.1 D23.C2 R22.1 R27.1 R44.1 U3.7(A6) U3.9(GND) U3.10(B6) U4.6(GND1) U4.18(GND2) U4.28(GND3) U4.39(GND4) ; also sheet 1,2,3,4,5,7,8,9
GND_LGC_EXT: C11.1 C104.1 J3.3
HV_IND_HIGH: U4.35(PA2(ADC2)) ; also sheet 7
HV_IND_LOW: U4.33(PA4(ADC4)) ; also sheet 7
HV_IND_MAX: U4.36(PA1(ADC1)) ; also sheet 7
HV_IND_MID: U4.34(PA3(ADC3)) ; also sheet 7
HV_IND_MIN: U4.32(PA5(ADC5)) ; also sheet 7
HV_SENSE_DIV_BR: R45.2 R46.1
KICK: R27.2 U4.40(PB0(XCK/T0)) ; also sheet 4
MCU_ERR: U4.25(PC6(TOSC1)) ; also sheet 7
MCU_INIT_OK: U4.30(PA7(ADC7)) ; also sheet 7
MCU_MODE: U4.26(PC7(TOSC2)) ; also sheet 7
MISO: U3.11(B5) U4.2(PB6(MISO))
MISO_EXT: J3.8 U3.6(A5)
MODE_SELECT: U4.19(PC0(SCL)) ; also sheet 9
MOSI: U3.12(B4) U4.1(PB5(MOSI))
MOSI_EXT: J3.7 U3.5(A4)
SCK: U3.13(B3) U4.3(PB7(SCK))
SCK_EXT: J3.6 U3.4(A3)
V+: R46.2 ; also sheet 2,4,5,7
VCC_LGC_EXT: C11.2 C104.2 J3.2 U3.2(VCCA) U3.8(OE)
VMON: D23.C1 R44.2 R45.1 U4.31(PA6(ADC6))
Unconnected: J3.1 U4.7(XTAL2) U4.8(XTAL1) U4.9(PD0(RXD)) U4.10(PD1(TXD)) U4.20(PC1(SDA)) U4.21(PC2(TCK)) U4.22(PC3(TMS)) U4.23(PC4(TDO)) U4.24(PC5(TDI))

### Notes on the sheet
- ATMEGA32 | Level Shifter
- Avoid JTAG pins
- Avoid JTAG pins
- Avoid JTAG pins
- Avoid JTAG pins
- Data Header | High Voltage Sense Divider
- R_up = 2 * 5.05M = 10.1M
  R_down = 149K
  Vmon_max_typ = 275V * (R_down/(R_up + R_down)) = 3.99V
  Max rated voltage for any pin on MCU is around 5V (input voltage),
  therefore the voltage divider can be adjusted to make VMON closer to 5V.
  But to account for the possibility of voltage spikes in excess of 600V,
  Vmon is adjusted to have the max typical voltage of around 4.0V with a protection diode

## Sheet 7 of 9: LED Indicators
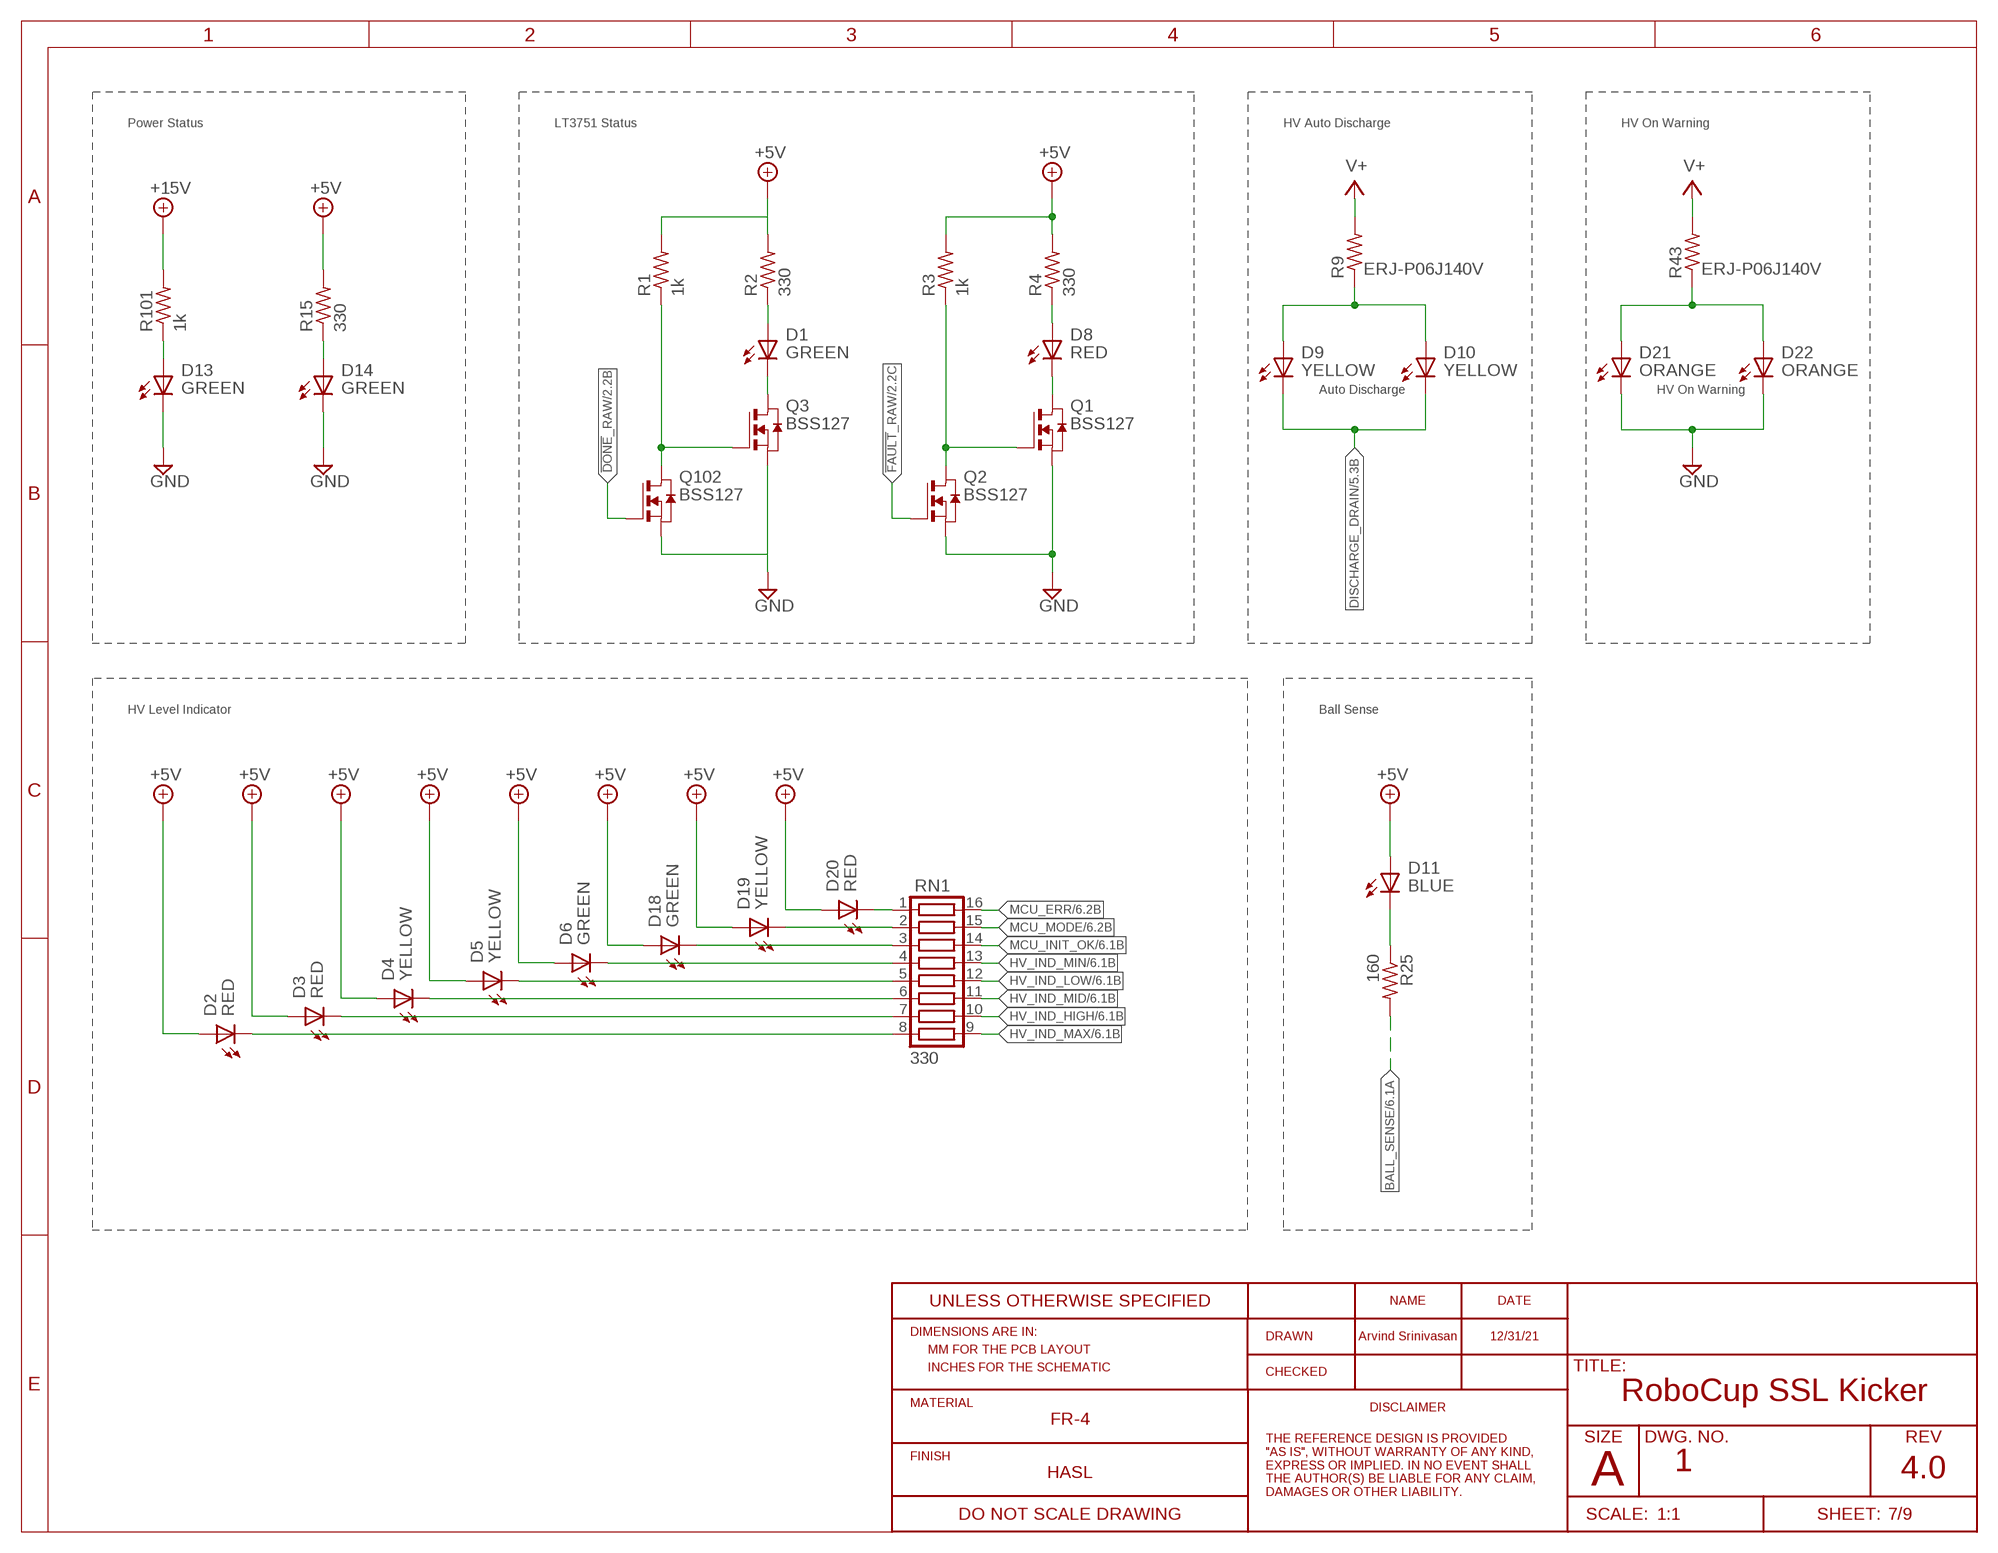
[diagram p6: schematic, sheet 7]
FRAME7 (RO_FRAME_A_L_20161226): REV: 4.0

### Parts
D1  GREEN  LED-SMD-GREEN  [CHIP-LED0603]
D2  RED  LED-SMD-RED  [CHIP-LED0603]
D3  RED  LED-SMD-RED  [CHIP-LED0603]
D4  YELLOW  LED-SMD-YELLOW  [CHIP-LED0603]
D5  YELLOW  LED-SMD-YELLOW  [CHIP-LED0603]
D6  GREEN  LED-SMD-GREEN  [CHIP-LED0603]
D8  RED  LED-SMD-RED  [CHIP-LED0603]
D9  YELLOW  LED-SMD-YELLOW  [CHIP-LED0603]
D10  YELLOW  LED-SMD-YELLOW  [CHIP-LED0603]
D11  BLUE  LED-SMD-BLUE  [CHIP-LED0603]
D13  GREEN  LED-SMD-GREEN  [CHIP-LED0603]
D14  GREEN  LED-SMD-GREEN  [CHIP-LED0603]
D18  GREEN  LED-SMD-GREEN  [CHIP-LED0603]
D19  YELLOW  LED-SMD-YELLOW  [CHIP-LED0603]
D20  RED  LED-SMD-RED  [CHIP-LED0603]
D21  ORANGE  LED-SMD  [CHIP-LED0603]
D22  ORANGE  LED-SMD  [CHIP-LED0603]
Q1  BSS127  [SOT-23-3]
Q2  BSS127  [SOT-23-3]
Q3  BSS127  [SOT-23-3]
Q102  BSS127  [SOT-23-3]
R1  1k  R-US_R0603  [R0603]
R2  330  R-US_R0603  [R0603]
R3  1k  R-US_R0603  [R0603]
R4  330  R-US_R0603  [R0603]
R9  ERJ-P06J140V  R-US_R0805  [R0805]
R15  330  R-US_R0603  [R0603]
R25  160  R-US_R0603  [R0603]
R43  ERJ-P06J140V  R-US_R0805  [R0805]
R101  1k  R-US_R0603  [R0603]
RN1  330  RA-8  [RA-8_2506]

### Nets
15V_PWR_BR: D13.A R101.1
!DONE!_RAW: Q102.1(G) ; also sheet 2,3
!FAULT!_RAW: Q2.1(G) ; also sheet 2,3
+5V: D2.A D3.A D4.A D5.A D6.A D11.A D18.A D19.A D20.A R1.2 R2.2 R3.2 R4.2 R15.2 ; also sheet 1,3,6,8,9
+15V: R101.2 ; also sheet 1,4
BALL_SENSE: R25.2 ; also sheet 6
BALL_SENSE_CL: D11.C(K) R25.1
DISCHARGE_DRAIN: D9.C(K) D10.C(K) ; also sheet 5
FAULT_INV_BR: Q1.1(G) Q2.3(D) R3.1
FAULT_INV_BR1: Q3.1(G) Q102.3(D) R1.1
GND: D13.C(K) D14.C(K) D21.C(K) D22.C(K) Q1.2(S) Q2.2(S) Q3.2(S) ; also sheet 1,2,3,4,5,6,8,9
GND1: Q102.2(S)
HV_IND_HIGH: RN1.10 ; also sheet 6
HV_IND_HIGH_CL: D3.C(K) RN1.7
HV_IND_LOW: RN1.12 ; also sheet 6
HV_IND_LOW_CL: D5.C(K) RN1.5
HV_IND_MAX: RN1.9 ; also sheet 6
HV_IND_MAX_CL: D2.C(K) RN1.8
HV_IND_MID: RN1.11 ; also sheet 6
HV_IND_MID_CL: D4.C(K) RN1.6
HV_IND_MIN: RN1.13 ; also sheet 6
HV_IND_MIN_CL: D6.C(K) RN1.4
MCU_ERR: RN1.16 ; also sheet 6
MCU_ERR_CL: D20.C(K) RN1.1
MCU_INIT_OK: RN1.14 ; also sheet 6
MCU_INIT_OK_CL: D18.C(K) RN1.3
MCU_MODE: RN1.15 ; also sheet 6
MCU_MODE_CL: D19.C(K) RN1.2
N$3: D21.A D22.A R43.1
N$5: D1.A R2.1
N$20: D14.A R15.1
N$27: D8.A R4.1
N$28: D8.C(K) Q1.3(D)
N$29: D9.A D10.A R9.1
N$37: D1.C(K) Q3.3(D)
V+: R9.2 R43.2 ; also sheet 2,4,5,6

### Notes on the sheet
- Power Status | LT3751 Status | HV Auto Discharge | HV On Warning
- Auto Discharge | HV On Warning
- HV Level Indicator | Ball Sense

## Sheet 8 of 9: Breakbeam
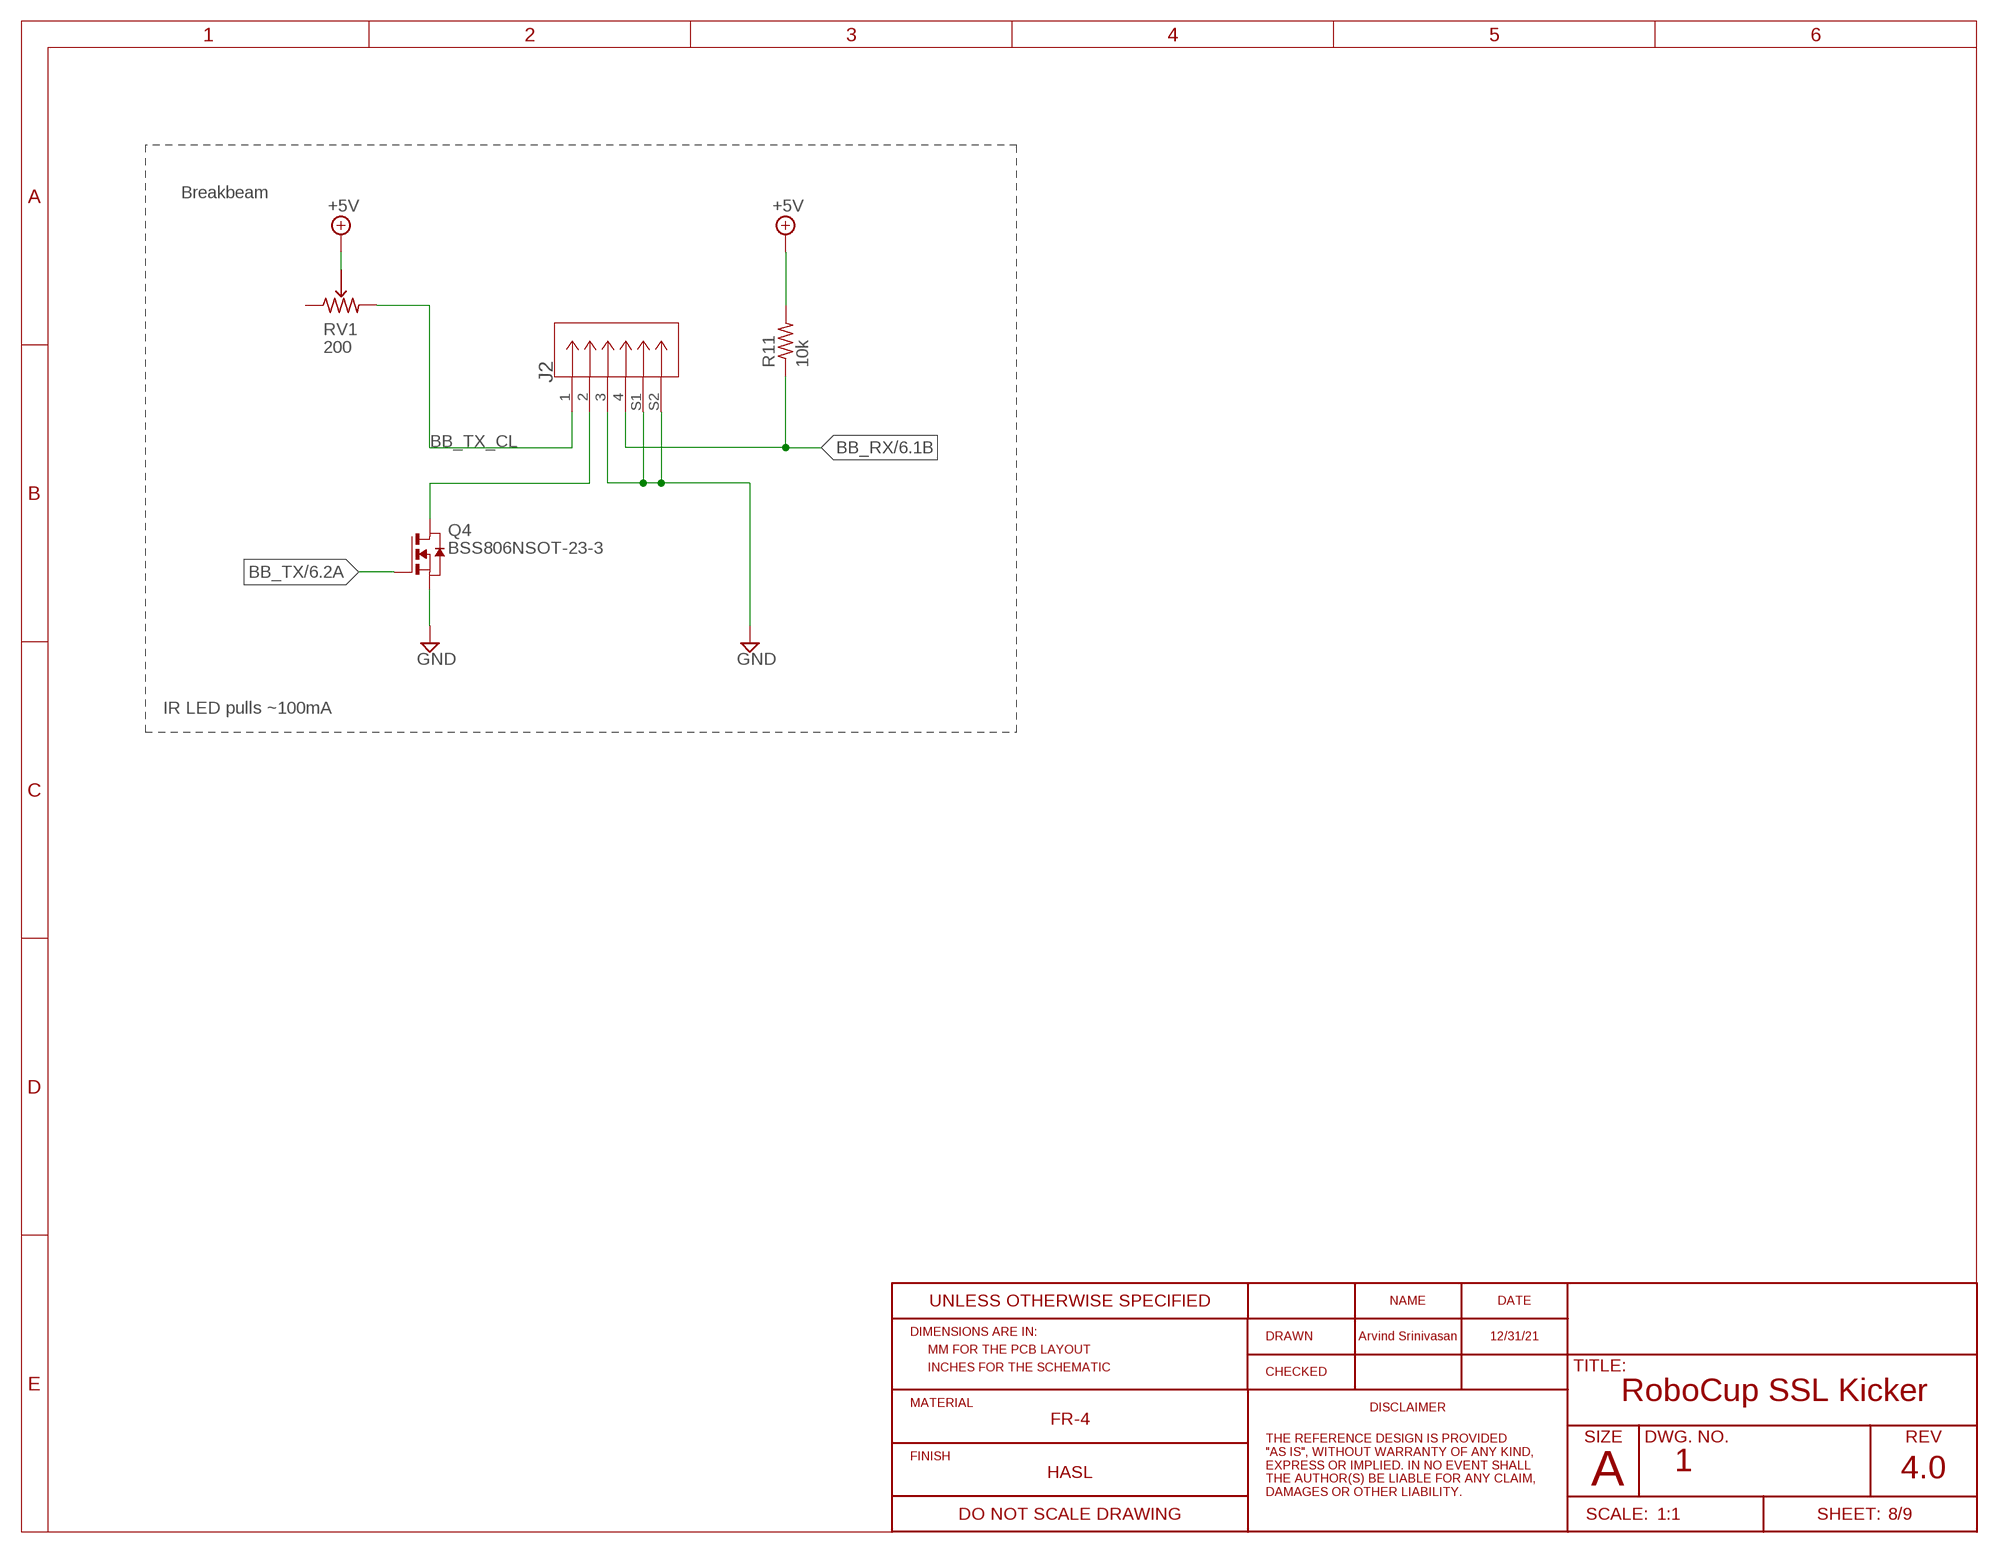
[diagram p7: schematic, sheet 8]
FRAME8 (RO_FRAME_A_L_20161226): REV: 4.0

### Parts
J2  430450411  [CON_430450411_MOL]
Q4  BSS806NSOT-23-3  [SOT95P240X110-3]
R11  10k  R-US_R0603  [R0603]
RV1  200  3214J  [3214J]

### Nets
+5V: R11.2 RV1.P$2(PIN2) ; also sheet 1,3,6,7,9
BB_RX: J2.4 R11.1 ; also sheet 6
BB_TX: Q4.1(G) ; also sheet 6
BB_TX_CL: J2.1 RV1.P$3(PIN3)
GND: J2.3 J2.S1 J2.S2 Q4.2(S) ; also sheet 1,2,3,4,5,6,7,9
N$19: J2.2 Q4.3(D)
Unconnected: RV1.P$1(PIN1)

### Notes on the sheet
- Breakbeam
- IR LED pulls ~100mA

## Sheet 9 of 9: User Input
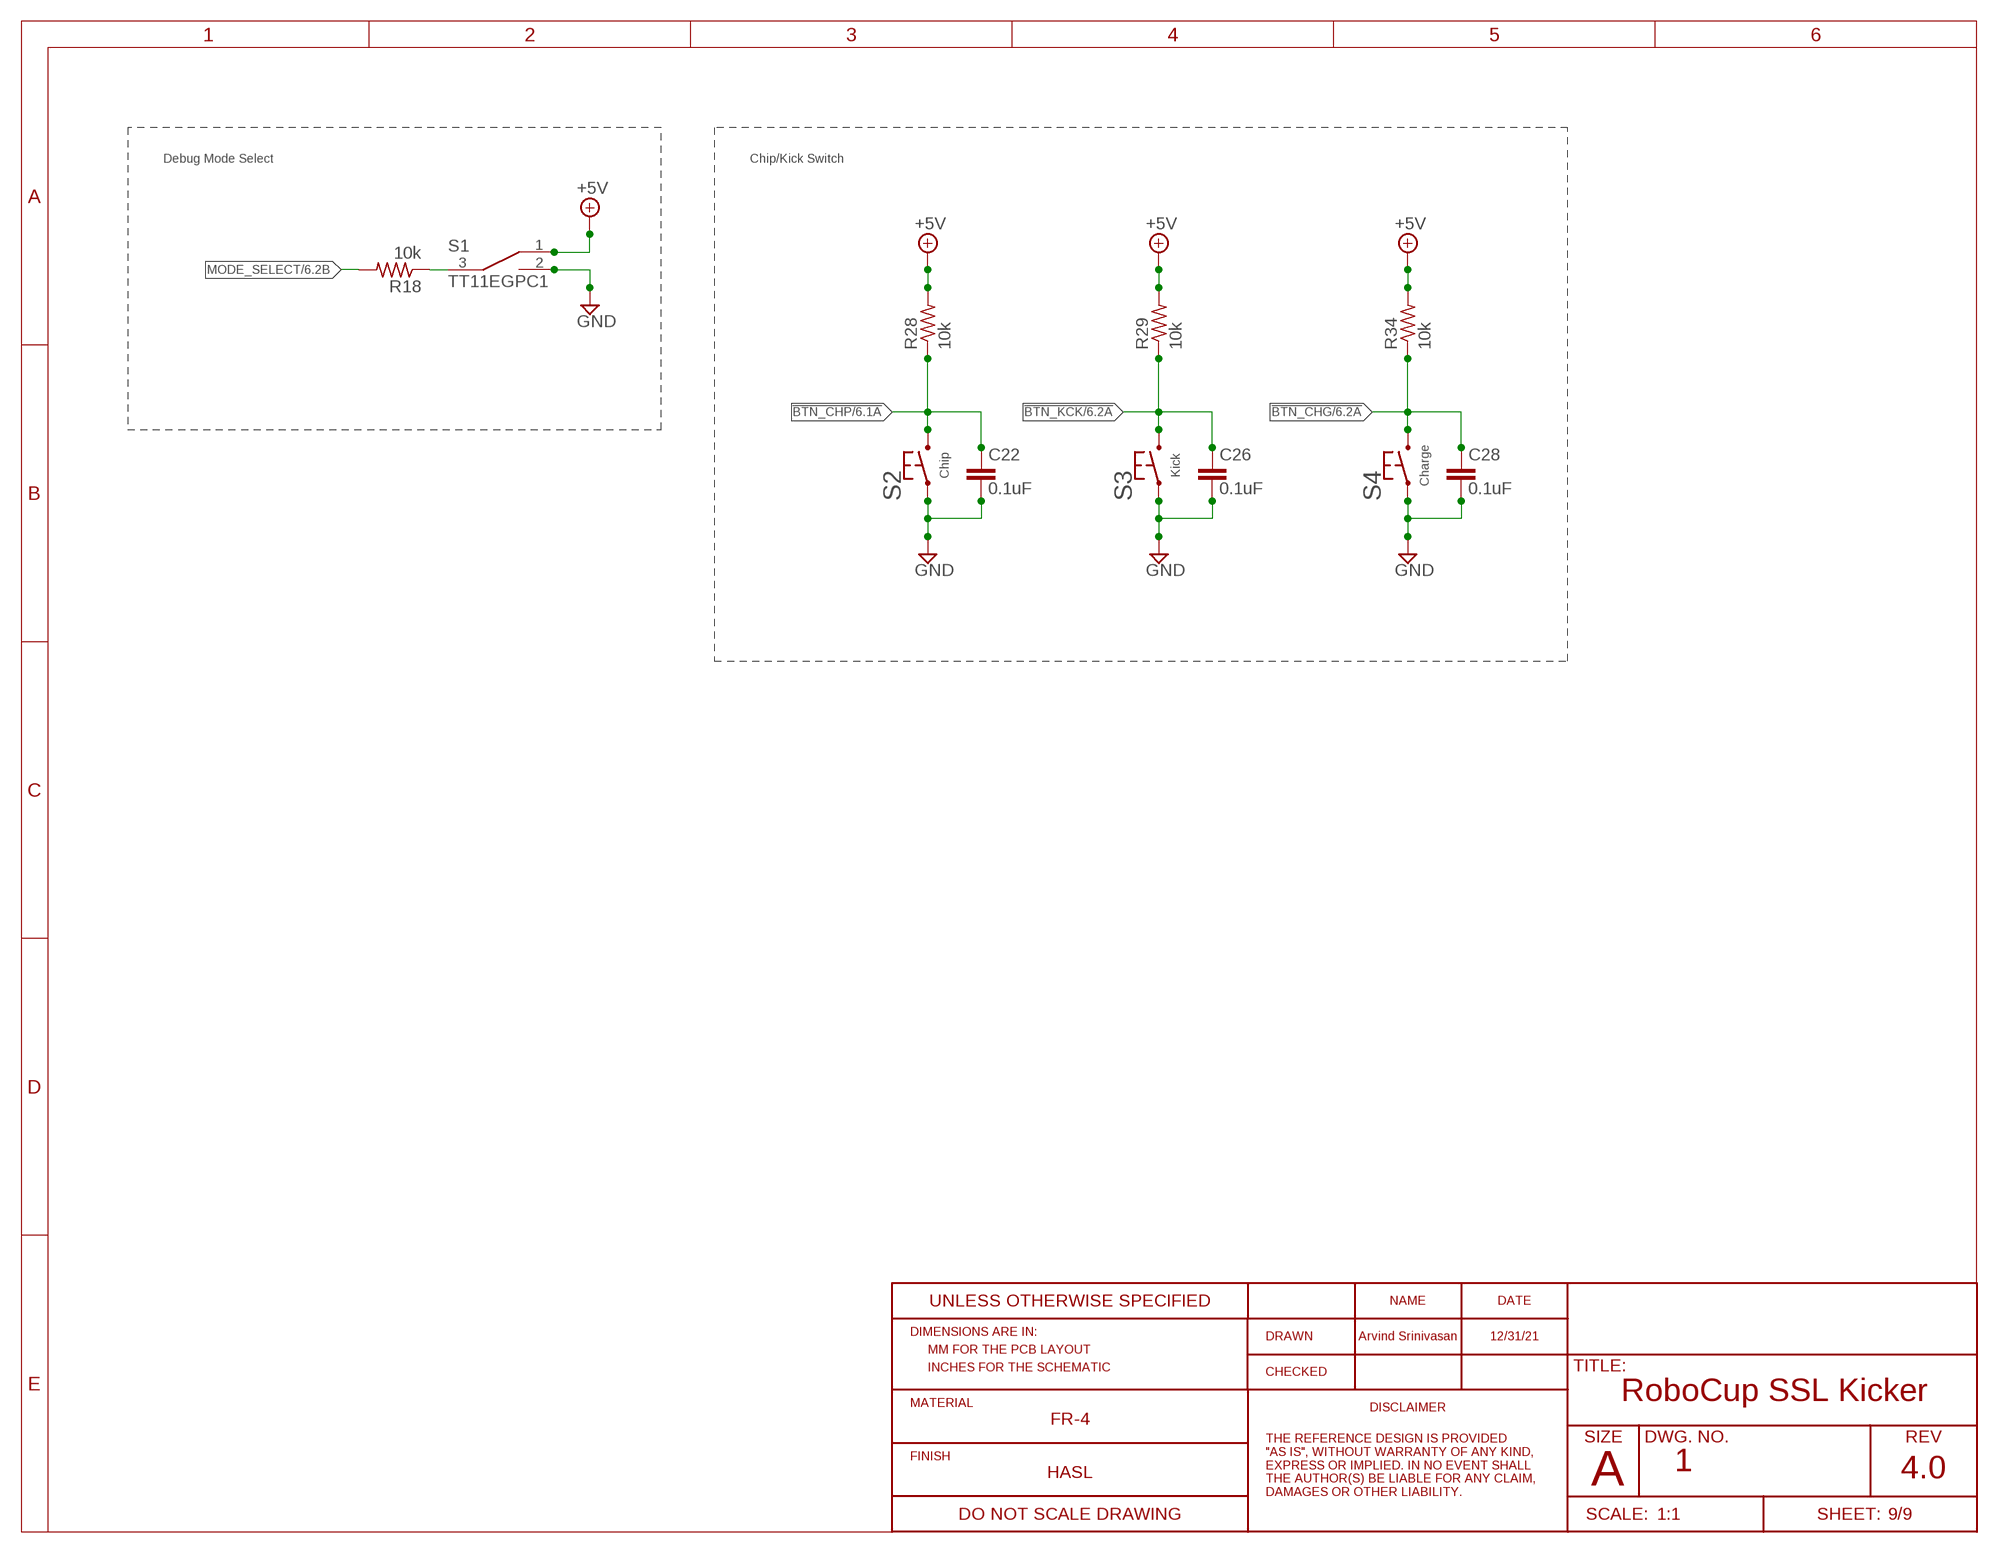
[diagram p8: schematic, sheet 9]

### Parts
C22  0.1uF  C-EUC0603  [C0603]
C26  0.1uF  C-EUC0603  [C0603]
C28  0.1uF  C-EUC0603  [C0603]
R18  10k  R-US_R0603  [R0603]
R28  10k  R-US_R0603  [R0603]
R29  10k  R-US_R0603  [R0603]
R34  10k  R-US_R0603  [R0603]
S1  TT11EGPC1  [TT11EGPC1]
S2  KSS32  [KSS32]
S3  KSS32  [KSS32]
S4  KSS32  [KSS32]

### Nets
!BTN_CHG: C28.1 R34.1 S4.2 ; also sheet 6
!BTN_CHP: C22.1 R28.1 S2.2 ; also sheet 6
!BTN_KCK: C26.1 R29.1 S3.2 ; also sheet 6
+5V: R28.2 R29.2 R34.2 S1.1(A) ; also sheet 1,3,6,7,8
GND: C22.2 C26.2 C28.2 S1.2(B) S2.1 S3.1 S4.1 ; also sheet 1,2,3,4,5,6,7,8
MODE_SELECT: R18.2 ; also sheet 6
N$14: R18.1 S1.3(COMMON)

### Notes on the sheet
- Debug Mode Select | Chip/Kick Switch

## Library data of the parts
C1 C2 C4-C31 C100-C109 = rcl:C-EU: CAPACITOR, European symbol; SPICEPREFIX: C
C3 C32-C35 = rcl:CPOL-US: POLARIZED CAPACITOR, American symbol; SPICEPREFIX: C
D1 D6 D7 D13 D14 D18 = RoboJackets-LEDs:LED-SMD; DIGIKEY: 160-1446-1-ND; MPN: LTST-C191KGKT
D2 D3 D8 D20 = RoboJackets-LEDs:LED-SMD; DIGIKEY: 160-1447-1-ND; MPN: LTST-C191KRKT
D4 D5 D9 D10 D19 = RoboJackets-LEDs:LED-SMD; DIGIKEY: 160-1448-1-ND; MPN: LTST-C191KSKT
D11 = RoboJackets-LEDs:LED-SMD; DIGIKEY: 160-1647-1-ND; MPN: LTST-C191TBKT
D12 = RoboJackets-Diodes:TVS: Suppressor diode
D15-D17 = RoboJackets-Diodes:VS-5EWH06FN-M3
D21 D22 = RoboJackets-LEDs:LED-SMD; DIGIKEY: 160-1445-1-ND; MPN: LTST-C191KFKT
D23 = RoboJackets-Diodes:PESD4V0Y1BSFYL: 3.7V (Typ) Clamp Ipp Tvs Diode Surface Mount DSN0603-2 DigiKey <https://www.digikey.com/product-detail/en/nexperia-usa-inc/PESD4V0Y1BSFYL/1727-7840-1-ND/9326518>; DKPN: 1727-7840-1-ND
D100 D101 = RoboJackets-Diodes:SMAJ20A
D102 = RoboJackets-Diodes:DIODE-: DIODE
F1 = RoboJackets-Fuses:CHIP_FUSE; DKPN: 478-13097-1-ND
F2 = RoboJackets-Fuses:CHIP_FUSE; DKPN: 478-2862-1-ND
J1 = RoboJackets-Connectors:436500217; DIGIKEY: WM12762-ND; MFR_NAME: Molex Connector Corporation; MPN: 436500217
J2 = RoboJackets-Connectors:430450411; DIGIKEY: WM1832CT-ND; MFR_NAME: Molex Connector Corporation; MPN: 430450411
J3 = RoboJackets-Connectors:SFW8S-2STE1LF
J100 J101 = RoboJackets-Connectors:436500202; DIGIKEY: WM3264-ND; MFR_NAME: Molex Connector Corporation; MPN: 436500202
Q1-Q3 Q101 Q102 = RoboJackets-Discrete:BSS127
Q4 = RoboJackets-Discrete:BSS806N
Q5 Q6 = RoboJackets-Discrete:IXGK400N30A3
Q7 = RoboJackets-Discrete:IRFS4227
Q100 = RoboJackets-Discrete:AOD1N60
R1-R46 R100 R101 R104-R110 = rcl:R-US_: RESISTOR, American symbol; SPICEPREFIX: R
R102 R103 = RoboJackets-Resistors:PWR263S-35; DIGIKEY: PWR263S-35-1501F
RN1 = RoboJackets-Resistors:RA-8: Resistor Array 8; DIGIKEY: 742C163331JPCT-ND; MPN: 742C163331JP
RV1 = RoboJackets-Resistors:3214J*; DIGIKEY: 3214J-201ETR-ND; MPN: 3214J
S1 = RoboJackets-Switches:TT11EGPC1
S2 = RoboJackets-Switches:KSS32; FUNCTION: Chip
S3 = RoboJackets-Switches:KSS32; FUNCTION: Kick
S4 = RoboJackets-Switches:KSS32; FUNCTION: Charge
T1 = RoboJackets-Inductors:DA203X-AL
U1 = RoboJackets-PowerICs:IX4427
U2 = RoboJackets-PowerICs:MPM3620GQV-P
U3 = RoboJackets-ICs:TXB0106PWR: Voltage Level Translator Bidirectional 1 Circuit 6 Channel 100Mbps 16-TSSOP Datasheet <https://www.ti.com/general/docs/suppproductinfo.tsp?distId=10&gotoUrl=http%253A%252F%252Fwww.ti.com%252Flit%252Fgpn%252Ftxb0106>; DKPN: 296-23759-1-ND
U4 = RoboJackets-ICs:AT32A
U5 = RoboJackets-ICs:LT3751
U100 = RoboJackets-PowerICs:MIC5235YM5
XF1 = RoboJackets-Fuses:3557-2; DIGIKEY: 36-3557-2-ND; MPN: 3557-2

## Net classes
0 default: clearance 0.205 mm